# EAGLE design pcb_khamex_zenit_V0.1_rev_5.6 (EAGLE 7.6.0)

## Sheet 1 of 2
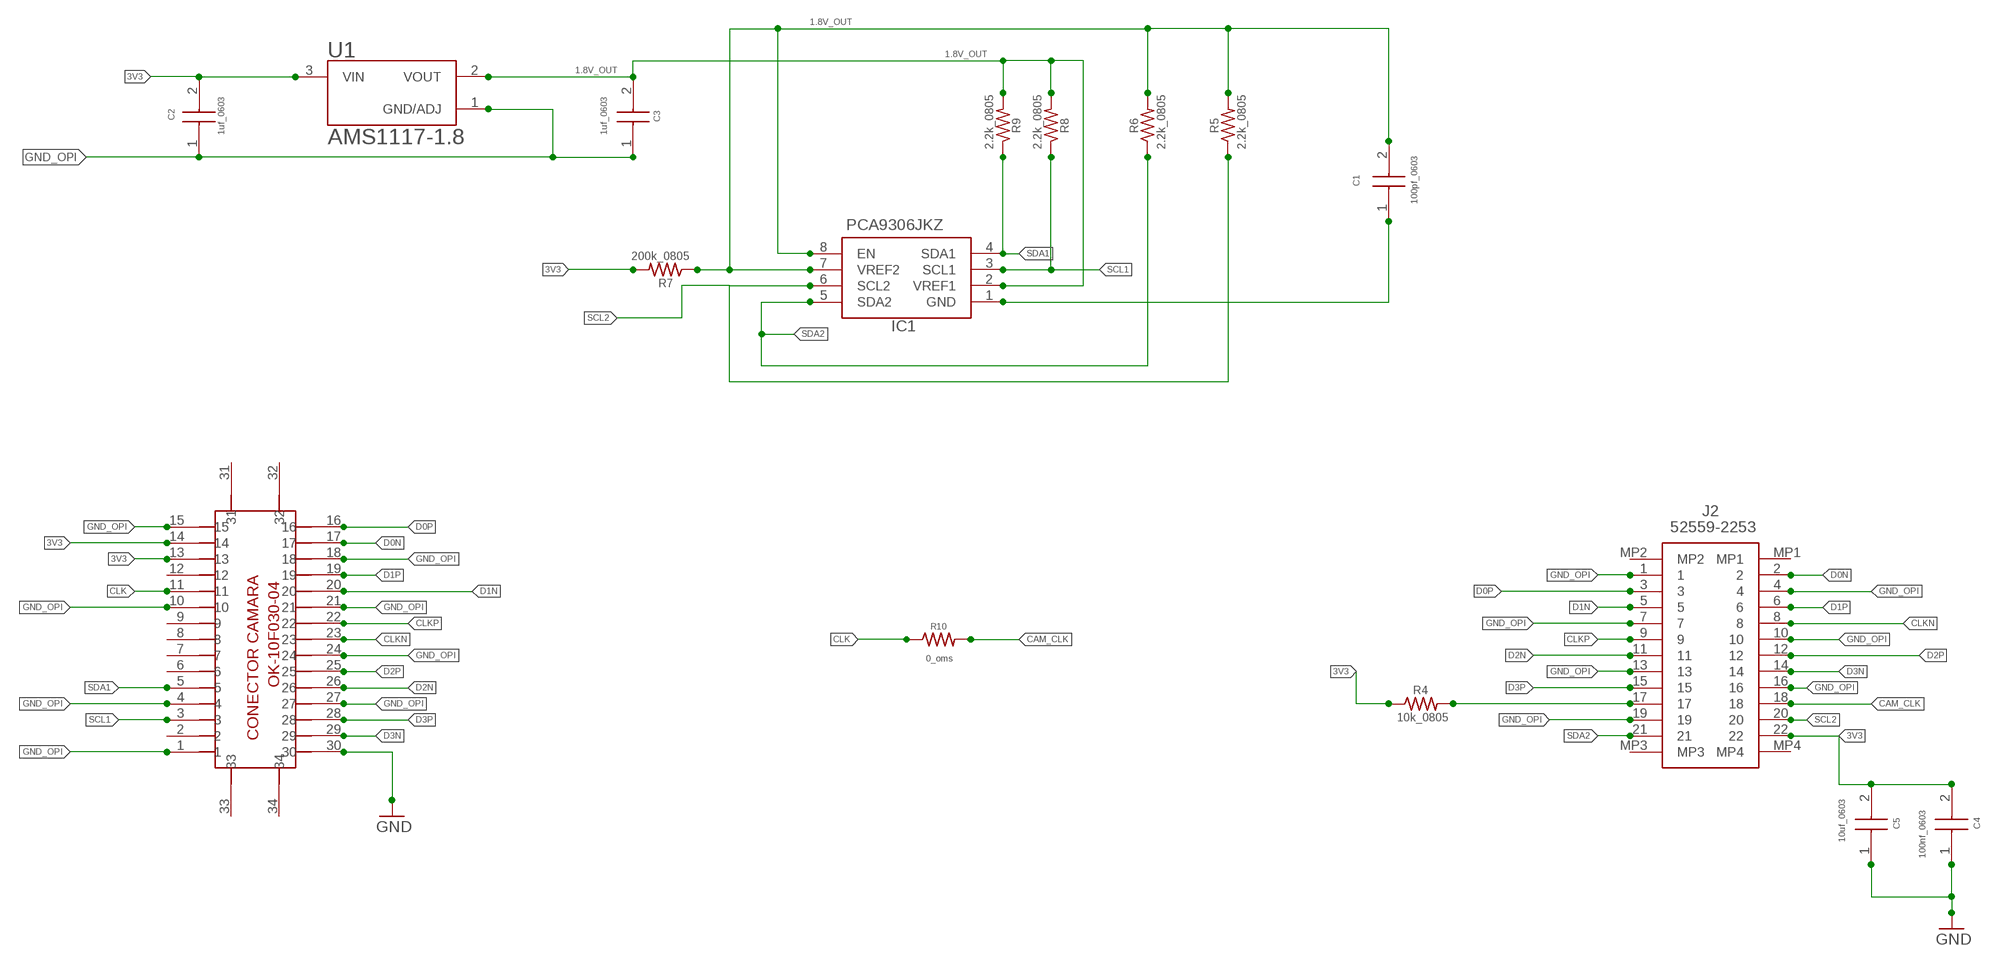
[diagram p0: schematic, sheet 1, part 1 of 2]
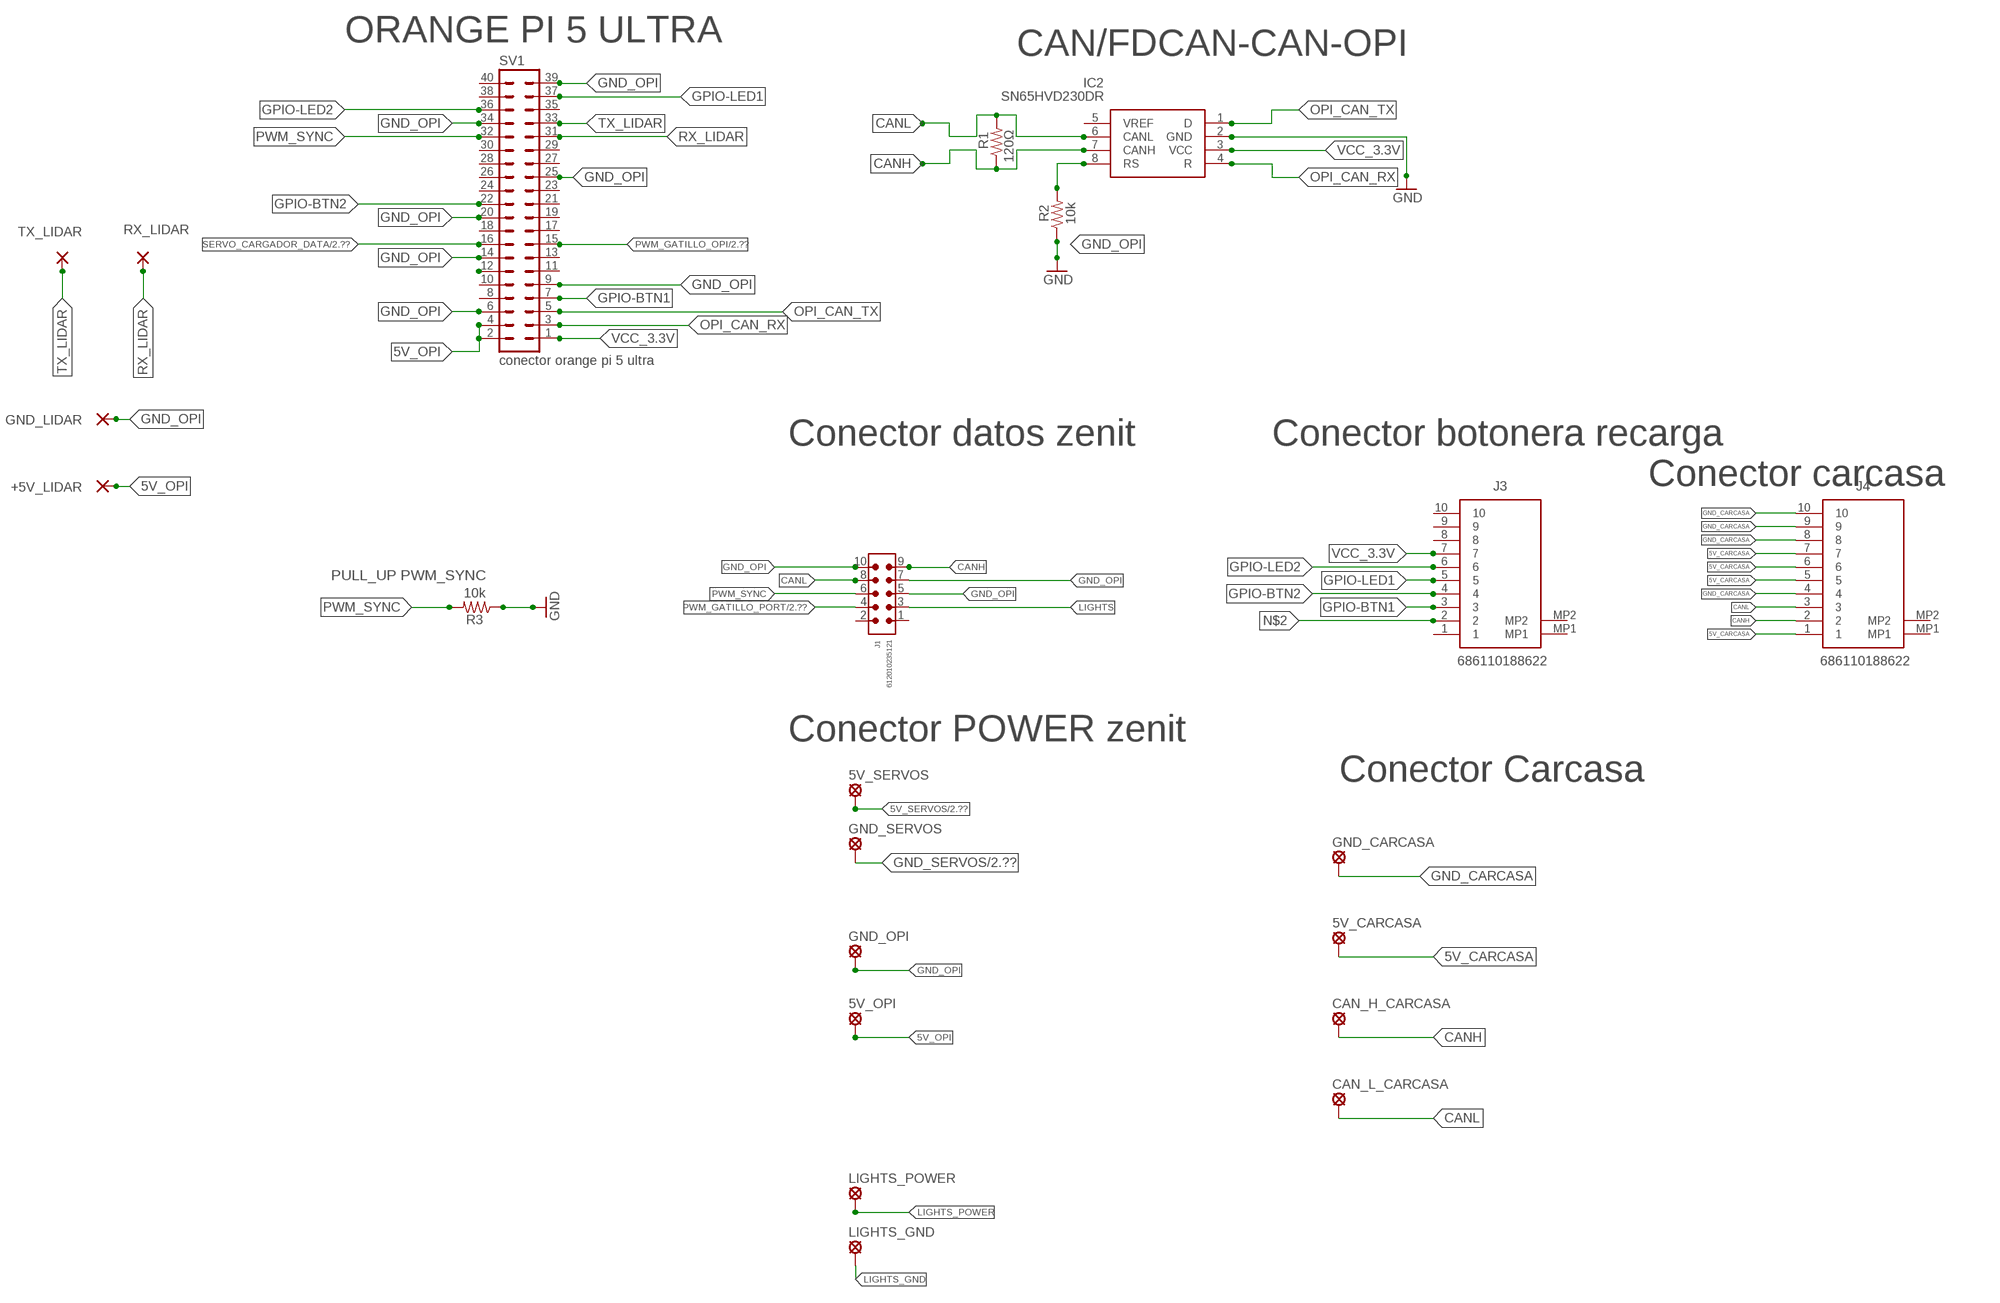
[diagram p1: schematic, sheet 1, part 2 of 2]

### Parts
5V_CARCASA  SE14  [SE14]
5V_OPI  SE14  [SE14]
5V_SERVOS  SE14  [SE14]
+5V_LIDAR  WIREPAD1,6/0,8  [1,6/0,8]
C1  100pf_0603  06033U101FAT2A  [CAPC1608X90N]
C2  1uf_0603  06033U101FAT2A  [CAPC1608X90N]
C3  1uf_0603  06033U101FAT2A  [CAPC1608X90N]
C4  100nf_0603  06033U101FAT2A  [CAPC1608X90N]
C5  10uf_0603  06033U101FAT2A  [CAPC1608X90N]
CAN_H_CARCASA  SE14  [SE14]
CAN_L_CARCASA  SE14  [SE14]
GND_CARCASA  SE14  [SE14]
GND_LIDAR  WIREPAD1,6/0,8  [1,6/0,8]
GND_OPI  SE14  [SE14]
GND_SERVOS  SE14  [SE14]
IC1  PCA9306JKZ  [PCA9306JKZ]
IC2  SN65HVD230DR  [SOT127P600X175-8N]
J1  612010235121  6120XX235121_612010235121  [612010235121]
J2  52559-2253  [525592253]
J3  686110188622  [686110188622]
J4  686110188622  [686110188622]
LIGHTS_GND  SE14  [SE14]
LIGHTS_POWER  SE14  [SE14]
R1  120Ω  R-US_M0805  [M0805]
R2  10k  R-US_M0805  [M0805]
R3  10k  R-US_R0603  [R0603]
R4  10k_0805  R-US_M0805  [M0805]
R5  2.2k_0805  R-US_M0805  [M0805]
R6  2.2k_0805  R-US_M0805  [M0805]
R7  200k_0805  R-US_M0805  [M0805]
R8  2.2k_0805  R-US_M0805  [M0805]
R9  2.2k_0805  R-US_M0805  [M0805]
R10  0_oms  R-US_M0805  [M0805]
RX_LIDAR  WIREPAD1,6/0,8  [1,6/0,8]
SV1  conector orange pi 5 ultra  MA20-2  [MA20-2]
TX_LIDAR  WIREPAD1,6/0,8  [1,6/0,8]
U1  AMS1117-1.8  [SOT229P700X180-4N]
U$1  OK-10F030-04_DEVICE  [OK-10F030-04_PACKAGE]

### Nets
1.8V: C3.2 IC1.2(VREF1) R8.2 R9.2 U1.2(VOUT)
3V3 [power]: C2.2 C4.2 C5.2 J2.22 R4.1 R7.2 U1.3(VIN) U$1.13 U$1.14
5V_CARCASA: 5V_CARCASA.MP J4.1 J4.5 J4.6 J4.7
5V_OPI: 5V_OPI.MP +5V_LIDAR.1(P) SV1.2 SV1.4
5V_SERVOS: 5V_SERVOS.MP ; also sheet 2
CAM_CLK: J2.18 R10.2
CANH: CAN_H_CARCASA.MP IC2.7(CANH) J1.9 J4.2 R1.1
CANL: CAN_L_CARCASA.MP IC2.6(CANL) J1.8 J4.3 R1.2
CLK: R10.1 U$1.11
CLKN: J2.8 U$1.23
CLKP: J2.9 U$1.22
D0N: J2.2 U$1.17
D0P: J2.3 U$1.16
D1N: J2.5 U$1.20
D1P: J2.6 U$1.19
D2N: J2.11 U$1.26
D2P: J2.12 U$1.25
D3N: J2.14 U$1.29
D3P [power]: J2.15 U$1.28
GND_CARCASA [power]: GND_CARCASA.MP J4.4 J4.8 J4.9 J4.10
GND_OPI [power]: C2.1 C3.1 C4.1 C5.1 GND_LIDAR.1(P) GND_OPI.MP IC2.2(GND) J1.5 J1.7 J1.10 J2.1 J2.4 J2.7 J2.10 J2.13 J2.16 J2.19 R2.1 R3.1 SV1.6 SV1.9 SV1.14 SV1.20 SV1.25 SV1.34 SV1.39 U1.1(GND/ADJ) U$1.1 U$1.4 U$1.10 U$1.15 U$1.18 U$1.21 U$1.24 U$1.27 U$1.30 ; supply symbol labelled GND ; also sheet 2
GND_SERVOS: GND_SERVOS.MP ; also sheet 2
GPIO-BTN1: J3.3 SV1.7
GPIO-BTN2: J3.4 SV1.22
GPIO-LED1: J3.5 SV1.37
GPIO-LED2: J3.6 SV1.36
LIGHTS [power]: J1.3
LIGHTS_GND [power]: LIGHTS_GND.MP
LIGHTS_POWER [power]: LIGHTS_POWER.MP
N$1: C1.1 IC1.1(GND)
N$2: J3.2
N$6: C1.2 IC1.7(VREF2) IC1.8(EN) R5.2 R6.2 R7.1
N$7: J2.17 R4.2
N$9: SV1.12
N$15: IC2.8(RS) R2.2
OPI_CAN_RX: IC2.4(R) SV1.3
OPI_CAN_TX: IC2.1(D) SV1.5
PWM_GATILLO_OPI: SV1.15 ; also sheet 2
PWM_GATILLO_PORT: J1.4 ; also sheet 2
PWM_SYNC: J1.6 R3.2 SV1.32
RX_LIDAR: RX_LIDAR.1(P) SV1.31
SCL1: IC1.3(SCL1) R8.1 U$1.3
SCL2: IC1.6(SCL2) J2.20 R5.1
SDA1: IC1.4(SDA1) R9.1 U$1.5
SDA2: IC1.5(SDA2) J2.21 R6.1
SERVO_CARGADOR_DATA: SV1.16 ; also sheet 2
TX_LIDAR: SV1.33 TX_LIDAR.1(P)
VCC_3.3V: IC2.3(VCC) J3.7 SV1.1
Unconnected: IC2.5(VREF) J1.1 J1.2 J2.MP1 J2.MP2 J2.MP3 J2.MP4 J3.1 J3.8 J3.9 J3.10 J3.MP1 J3.MP2 J4.MP1 J4.MP2 SV1.8 SV1.10 SV1.11 SV1.13 SV1.17 SV1.18 SV1.19 SV1.21 SV1.23 SV1.24 SV1.26 SV1.27 SV1.28 SV1.29 SV1.30 SV1.35 SV1.38 SV1.40 U$1.2 U$1.6 U$1.7 U$1.8 U$1.9 U$1.12 U$1.31 U$1.32 U$1.33 U$1.34

### Notes on the sheet
- 1.8V_OUT
- 1.8V_OUT
- 1.8V_OUT
- ORANGE PI 5 ULTRA
- CAN/FDCAN-CAN-OPI
- Conector datos zenit | Conector botonera recarga
- Conector carcasa
- PULL_UP PWM_SYNC
- Conector POWER zenit
- Conector Carcasa

## Sheet 2 of 2
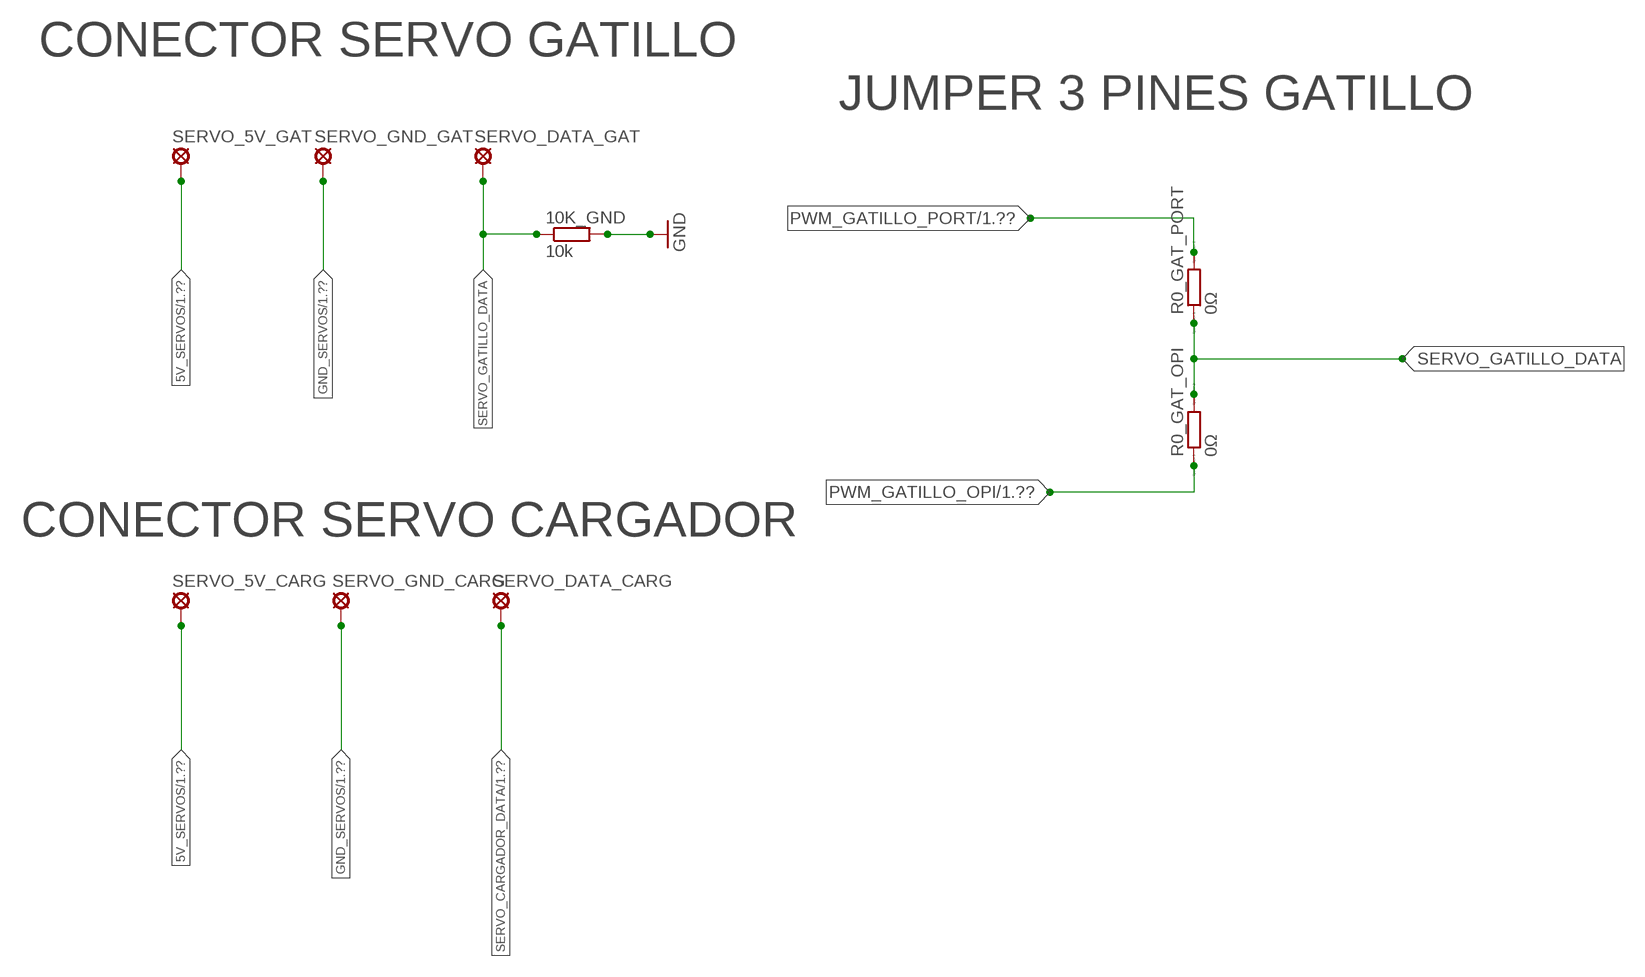
[diagram p2: schematic, sheet 2]

### Parts
10K_GND  10k  R-EU_R0603  [R0603]
R0_GAT_OPI  0Ω  RR0603  [R0603]
R0_GAT_PORT  0Ω  RR0603  [R0603]
SERVO_5V_CARG  SE14  [SE14]
SERVO_5V_GAT  SE14  [SE14]
SERVO_DATA_CARG  SE14  [SE14]
SERVO_DATA_GAT  SE14  [SE14]
SERVO_GND_CARG  SE14  [SE14]
SERVO_GND_GAT  SE14  [SE14]

### Nets
5V_SERVOS: SERVO_5V_CARG.MP SERVO_5V_GAT.MP ; also sheet 1
GND_OPI [power]: 10K_GND.2 ; supply symbol labelled GND ; also sheet 1
GND_SERVOS: SERVO_GND_CARG.MP SERVO_GND_GAT.MP ; also sheet 1
PWM_GATILLO_OPI: R0_GAT_OPI.1 ; also sheet 1
PWM_GATILLO_PORT: R0_GAT_PORT.2 ; also sheet 1
SERVO_CARGADOR_DATA: SERVO_DATA_CARG.MP ; also sheet 1
SERVO_GATILLO_DATA: 10K_GND.1 R0_GAT_OPI.2 R0_GAT_PORT.1 SERVO_DATA_GAT.MP

### Notes on the sheet
- CONECTOR SERVO GATILLO
- JUMPER 3 PINES GATILLO
- CONECTOR SERVO CARGADOR

## Library data of the parts
5V_CARCASA 5V_OPI 5V_SERVOS CAN_H_CARCASA CAN_L_CARCASA GND_CARCASA GND_OPI GND_SERVOS LIGHTS_GND LIGHTS_POWER SERVO_5V_CARG SERVO_5V_GAT SERVO_DATA_CARG SERVO_DATA_GAT SERVO_GND_CARG SERVO_GND_GAT = solpad:SE14: SOLDER PAD E1553, drill 1,4mm, distributor Buerklin, 07F820
10K_GND = rcl_dani:R-EU_: RESISTOR, European symbol
+5V_LIDAR GND_LIDAR RX_LIDAR TX_LIDAR = wirepad:WIREPAD: Wire PAD connect wire on PCB
C1-C5 = 06033U101FAT2A:06033U101FAT2A: Multilayer Ceramic Capacitors MLCC - SMD/SMT 25V 100pF C0G 0603 1% Tol Source: Datasheet <https://componentsearchengine.com/Datasheets/1/06031A100FAT2A.pdf>; DESCRIPTION: Multilayer Ceramic Capacitors MLCC - SMD/SMT 25V 100pF C0G 0603 1% Tol; HEIGHT: 0.9mm; MANUFACTURER_NAME: Kyocera AVX; MANUFACTURER_PART_NUMBER: 06033U101FAT2A
IC1 = PCA9306JKZ:PCA9306JKZ: Voltage Level Translator Bidirectional 1 Circuit 2 Channel 8-X2SON (1.35x1) , 1.8 V ~ 5.5 V , -40C ~ 105C (TA) Source: Datasheet <https://www.nxp.com/docs/en/data-sheet/PCA9306.pdf>; DESCRIPTION: Voltage Level Translator Bidirectional 1 Circuit 2 Channel 8-X2SON (1.35x1) , 1.8 V ~ 5.5 V , -40C ~ 105C (TA); HEIGHT: 0.33mm; MANUFACTURER_NAME: NXP; MANUFACTURER_PART_NUMBER: PCA9306JKZ
IC2 = SN65HVD230DR:SN65HVD230DR: 3.3 V CAN Transceiver with Standby Mode Source: Datasheet <http://www.ti.com/lit/gpn/sn65hvd230>; DESCRIPTION: 3.3 V CAN Transceiver with Standby Mode; HEIGHT: 1.75mm; MANUFACTURER_NAME: Texas Instruments; MANUFACTURER_PART_NUMBER: SN65HVD230DR; MOUSER_PART_NUMBER: 595-SN65HVD230DR; MOUSER_PRICE-STOCK: https://www.mouser.co.uk/ProductDetail/Texas-Instruments/SN65HVD230DR?qs=QViXGNcIEAtifeQR3pYVUQ%3D%3D
J1 = Eagle_WR-BHD_rev24a:6120XX235121_612010235121: WR-BHD 2.54 mm Male Box Header High Temperature KIND PROPERTIES: Pitch 2.54 mm Gender:Male MATERIAL PROPERTIES: Insulator Material:PA6T Insulator Flammability Rating UL94 V-0 Insulator Color:Black Contact Material :Copper Alloy Contact Plating :Gold Contact Type: Stamped GENERAL INFORMATION: Operating Temperature:-40 °C up to +125 °C Compliance:RoHS Working Voltage: 250 V (AC) Withstanding Voltage:500 V (AC) Contact Resistance: 20 mΩ Insulation Resistance:1000 MΩ PACKAGING PROPERTIES Packaging :Tray <https://www.we-online.com/catalog/media/o32904v209%20Family_WR-BHD_6120xx235121.jpg> Details see: https://www.we-online.com/catalog/en/BHD_2_54_MALE_BOX_HEADER_HIGH_TEMPERATURE_6120XX235121 Updated by Ella Wu 2021-03-12 2021 (C) Würth Elektronik; CONTACT-RESISTANCE: 20mOhm; DATASHEET-URL: https://www.we-online.com/redexpert/spec/612010235121?ae; GENDER: Male; IR: 3A; LENGTH: 20.3mm; MOUNT: THT; PACKAGING: Tray; PART-NUMBER: 612010235121; PINS: 10; PITCH: 2.54mm; TYPE: Straight; WORKING-VOLTAGE: 250V(AC)
J2 = 52559-2253:52559-2253: 0.5 MM FPC CONNECTOR Source: Datasheet; DESCRIPTION: 0.5 MM FPC CONNECTOR; HEIGHT: 5.55mm; MANUFACTURER_NAME: Molex; MANUFACTURER_PART_NUMBER: 52559-2253; MOUSER_PART_NUMBER: 538-52559-2253; MOUSER_PRICE-STOCK: https://www.mouser.co.uk/ProductDetail/Molex/52559-2253?qs=nDwhpid8gJaCOR81Wp3jsw%3D%3D
J3 J4 = 686110188622:686110188622: FFC & FPC Connectors WR-FPC 1,0mm SMT Horiz. Top Contact Tin Plating{0000} Source: Datasheet <https://www.mouser.ch/datasheet/2/445/686110188622-1843591.pdf>; DESCRIPTION: FFC & FPC Connectors WR-FPC 1,0mm SMT Horiz. Top Contact Tin Plating{0000}; HEIGHT: 3.3mm; MANUFACTURER_NAME: Wurth Elektronik; MANUFACTURER_PART_NUMBER: 686110188622; MOUSER_PART_NUMBER: 710-686110188622; MOUSER_PRICE-STOCK: https://www.mouser.co.uk/ProductDetail/Wurth-Elektronik/686110188622?qs=OlC7AqGiEDnHUpT6yh27Lg%3D%3D
R0_GAT_OPI R0_GAT_PORT = eagle-ltspice:R: RESISTOR, European symbol; SPICEMODEL: NONE; SPICEPREFIX: R
R1-R10 = rcl:R-US_: RESISTOR, American symbol
SV1 = con-lstb:MA20-2: PIN HEADER; OC_FARNELL: unknown; OC_NEWARK: unknown
U1 = AMS1117-1.8 (1):AMS1117-1.8: Check availability <https://pricing.snapeda.com/parts/AMS1117-1.8-TR/ams/view-part?ref=eda>; AVAILABILITY: Not in stock; CHECK_PRICES: https://www.snapeda.com/parts/AMS1117-1.8-TR/ams/view-part/?ref=eda; MF: ams; MP: AMS1117-1.8-TR; PACKAGE: SOT-223 Seeed Technology; PRICE: None; SNAPEDA_LINK: https://www.snapeda.com/parts/AMS1117-1.8-TR/ams/view-part/?ref=snap
U$1 = OK-10F030-04_LIBRARY_2:OK-10F030-04_DEVICE: Conector para las camaras del Orange Pi 5 Ultra 30 pines click

## Net classes
0 default: width 0.15 mm, drill 0.3 mm, clearance 0.15 mm
1 power: width 0.127 mm, drill 0.305 mm, clearance 0.127 mm
2 thin: width 0.254 mm, drill 0.254 mm, clearance 0.254 mm
3 mipi: width 0.15 mm, drill 0.2 mm, clearance 0.15 mm

## Board
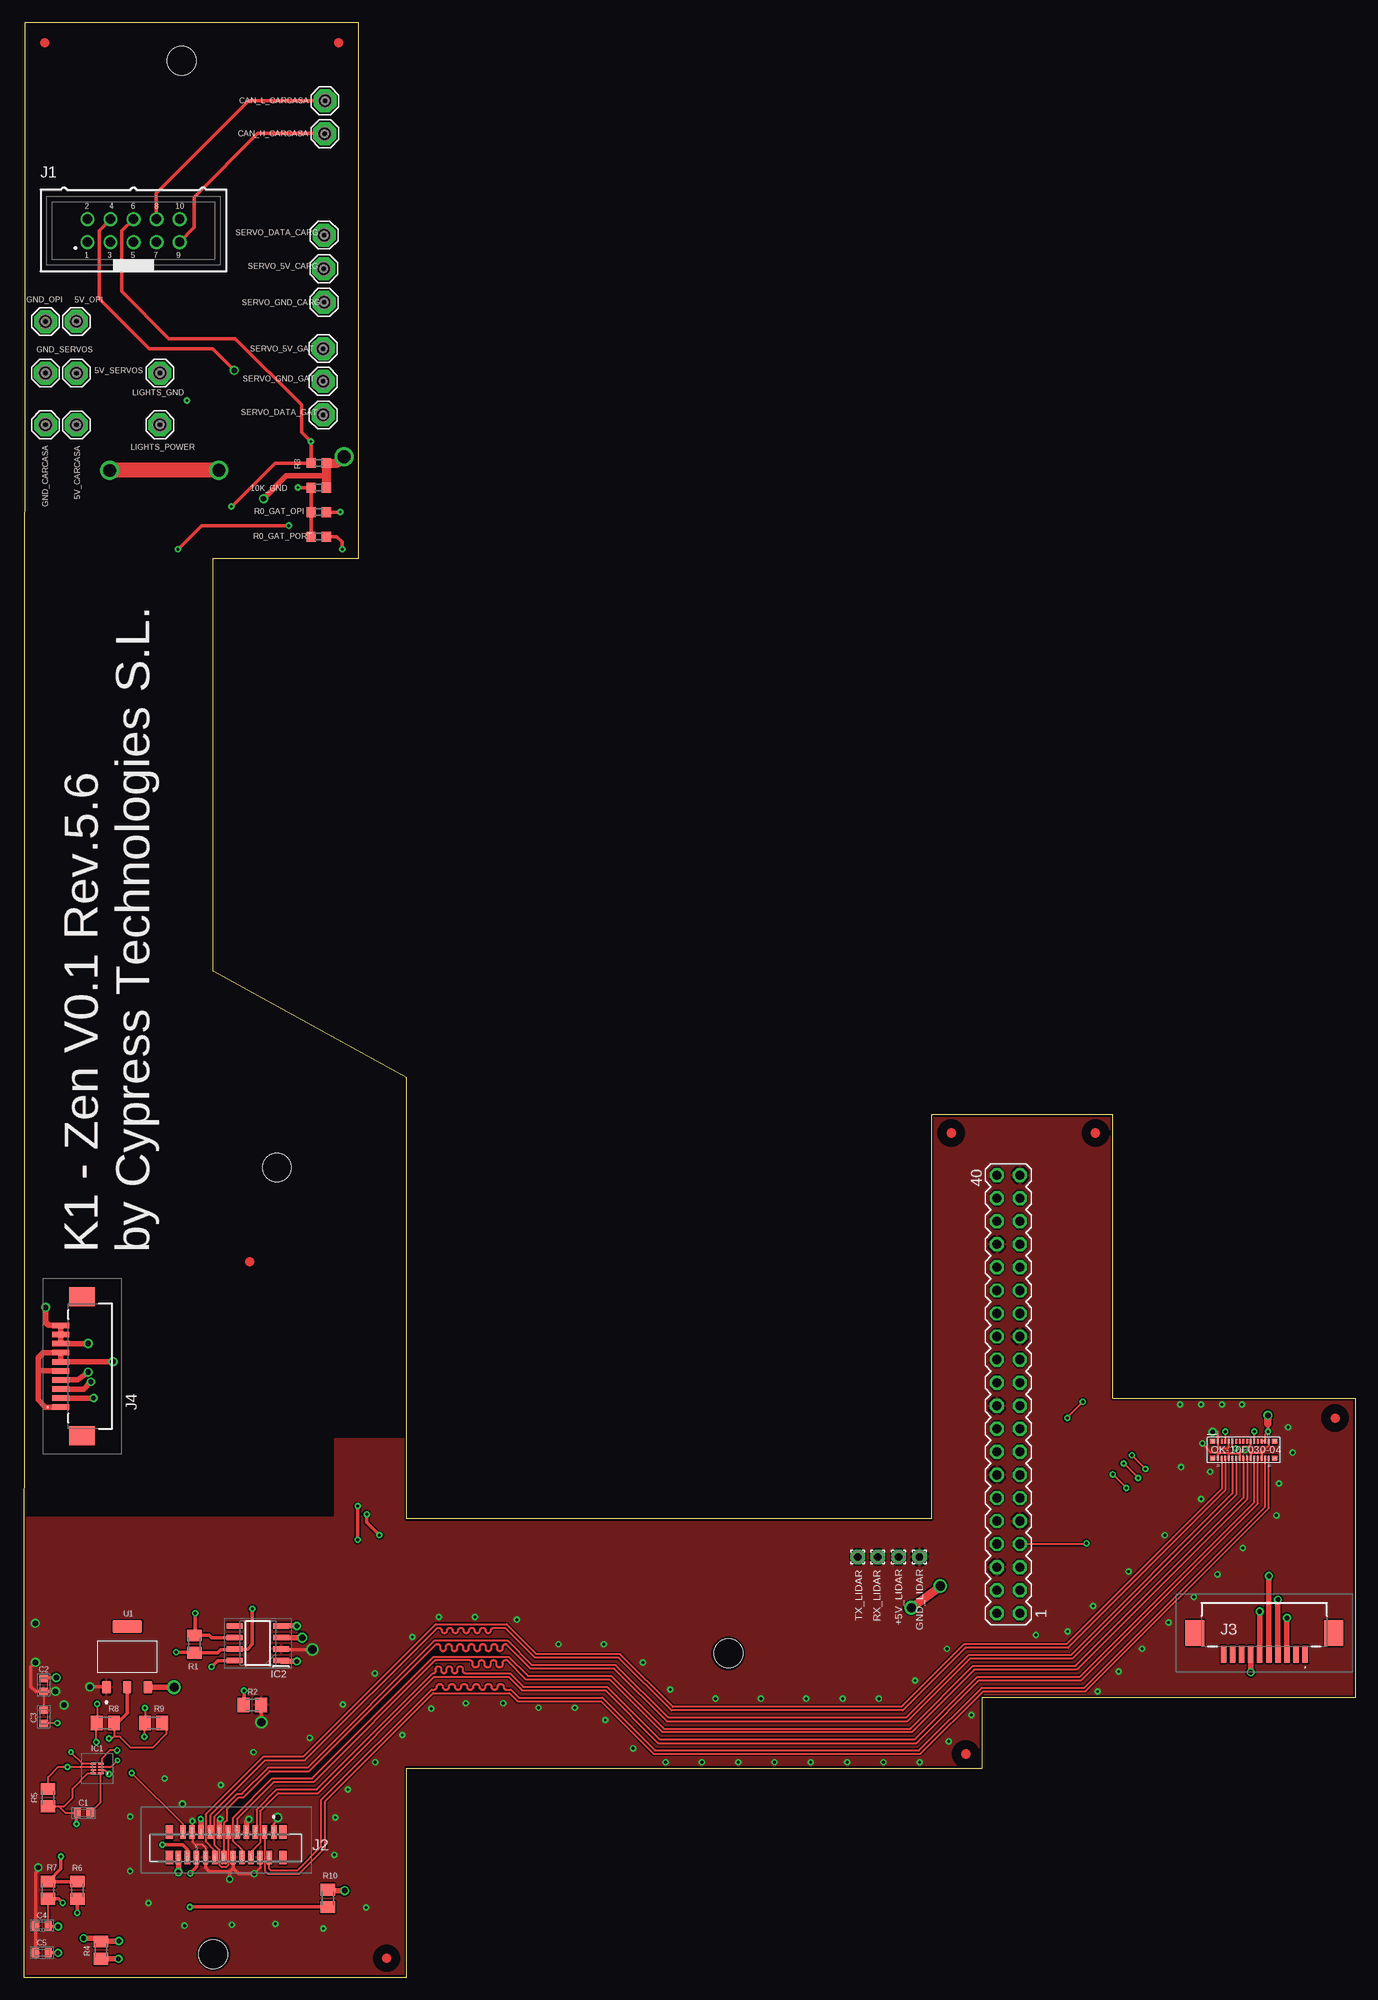
[diagram p3: board, top side]
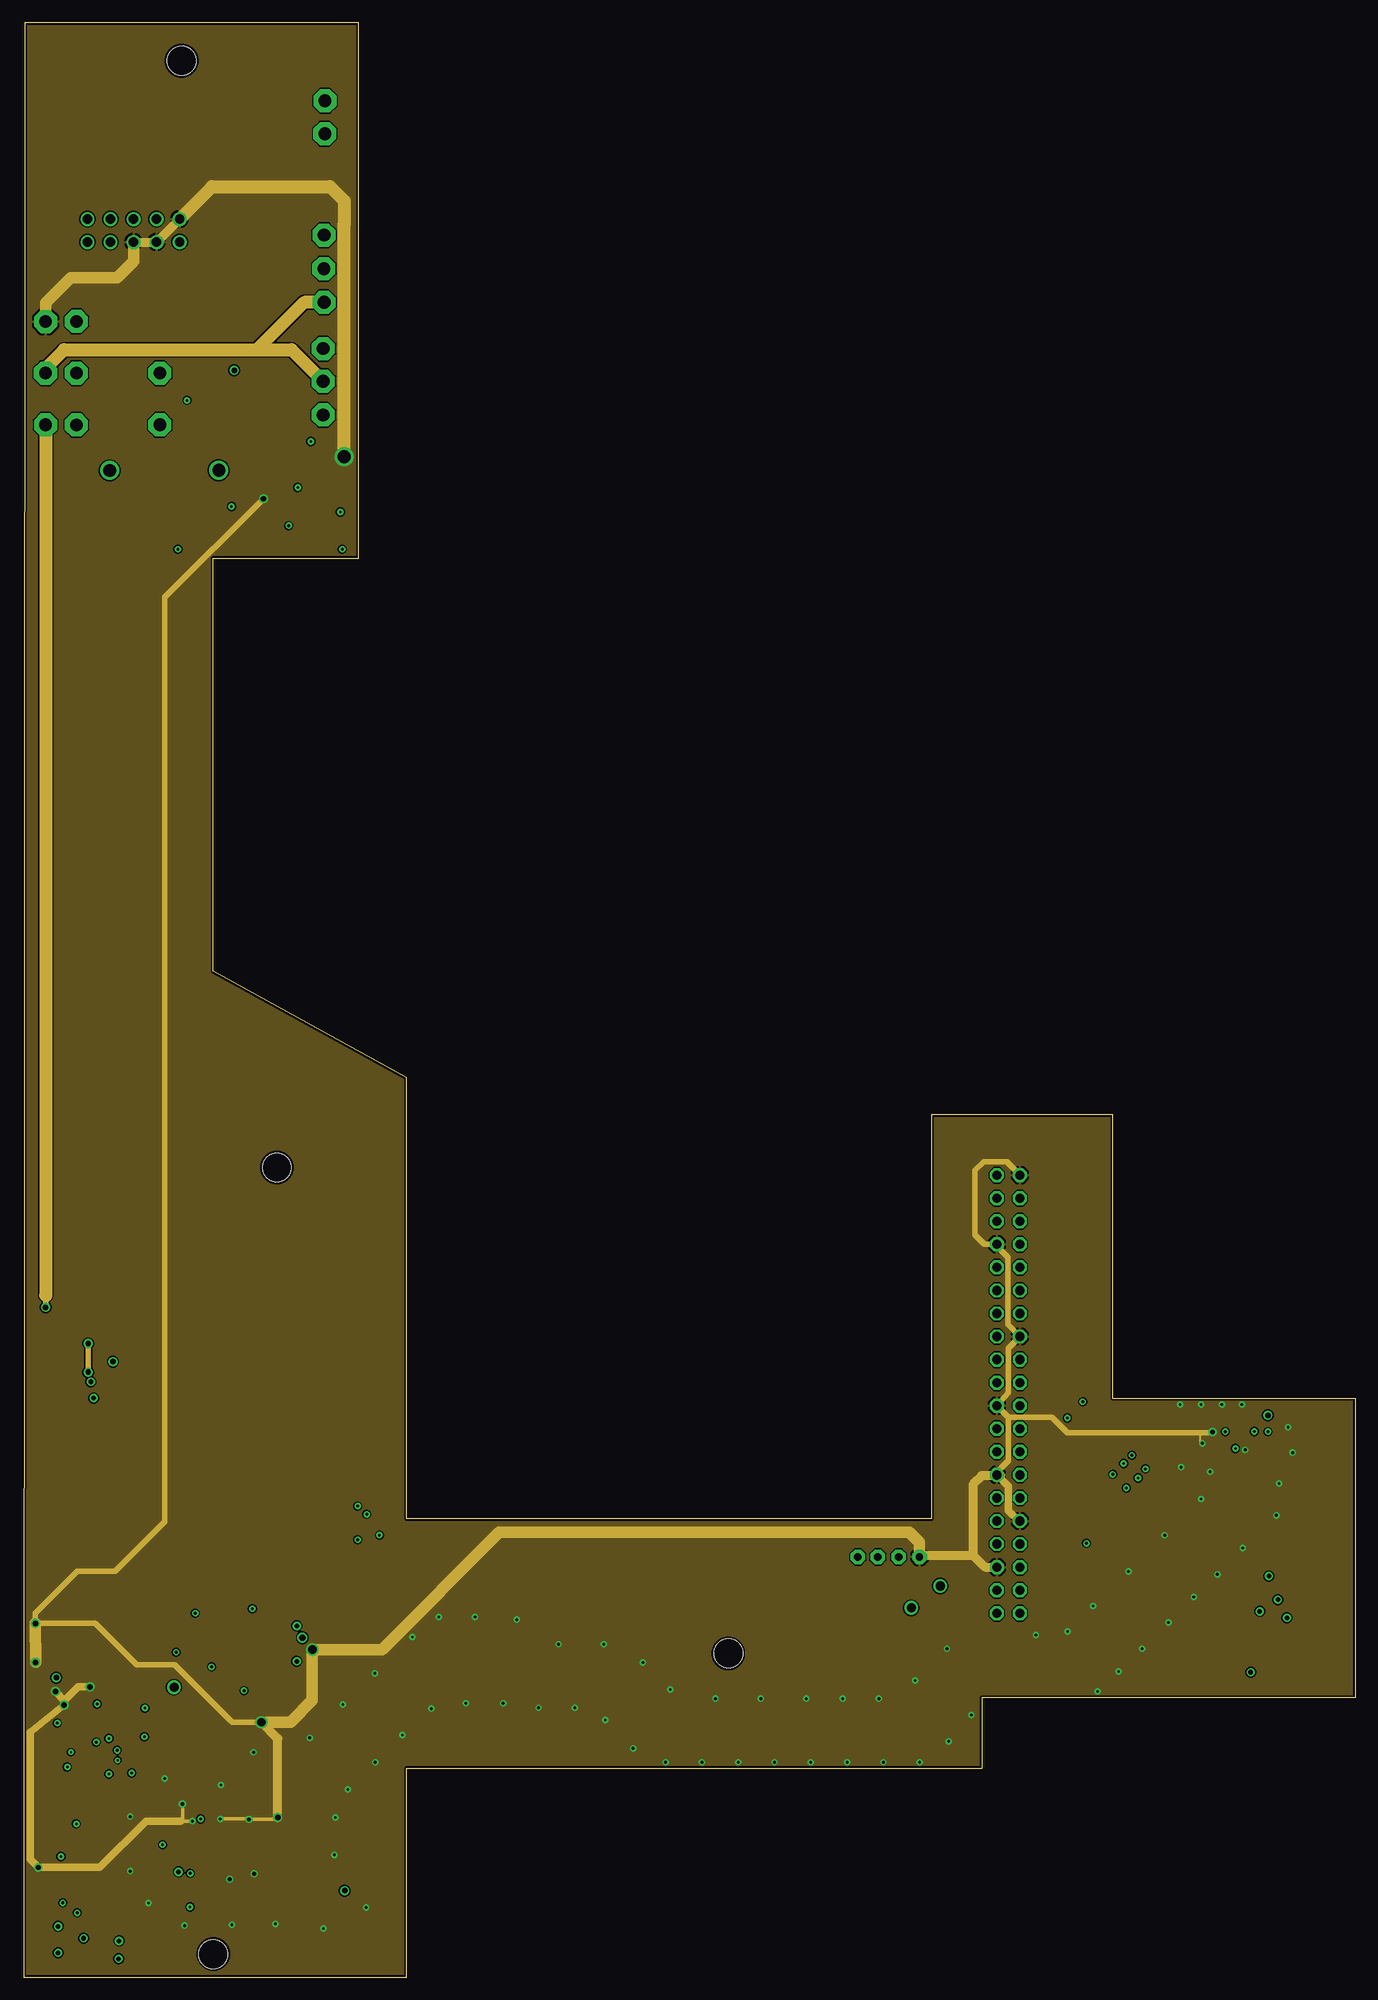
[diagram p4: board, inner layer GND_PLANE]
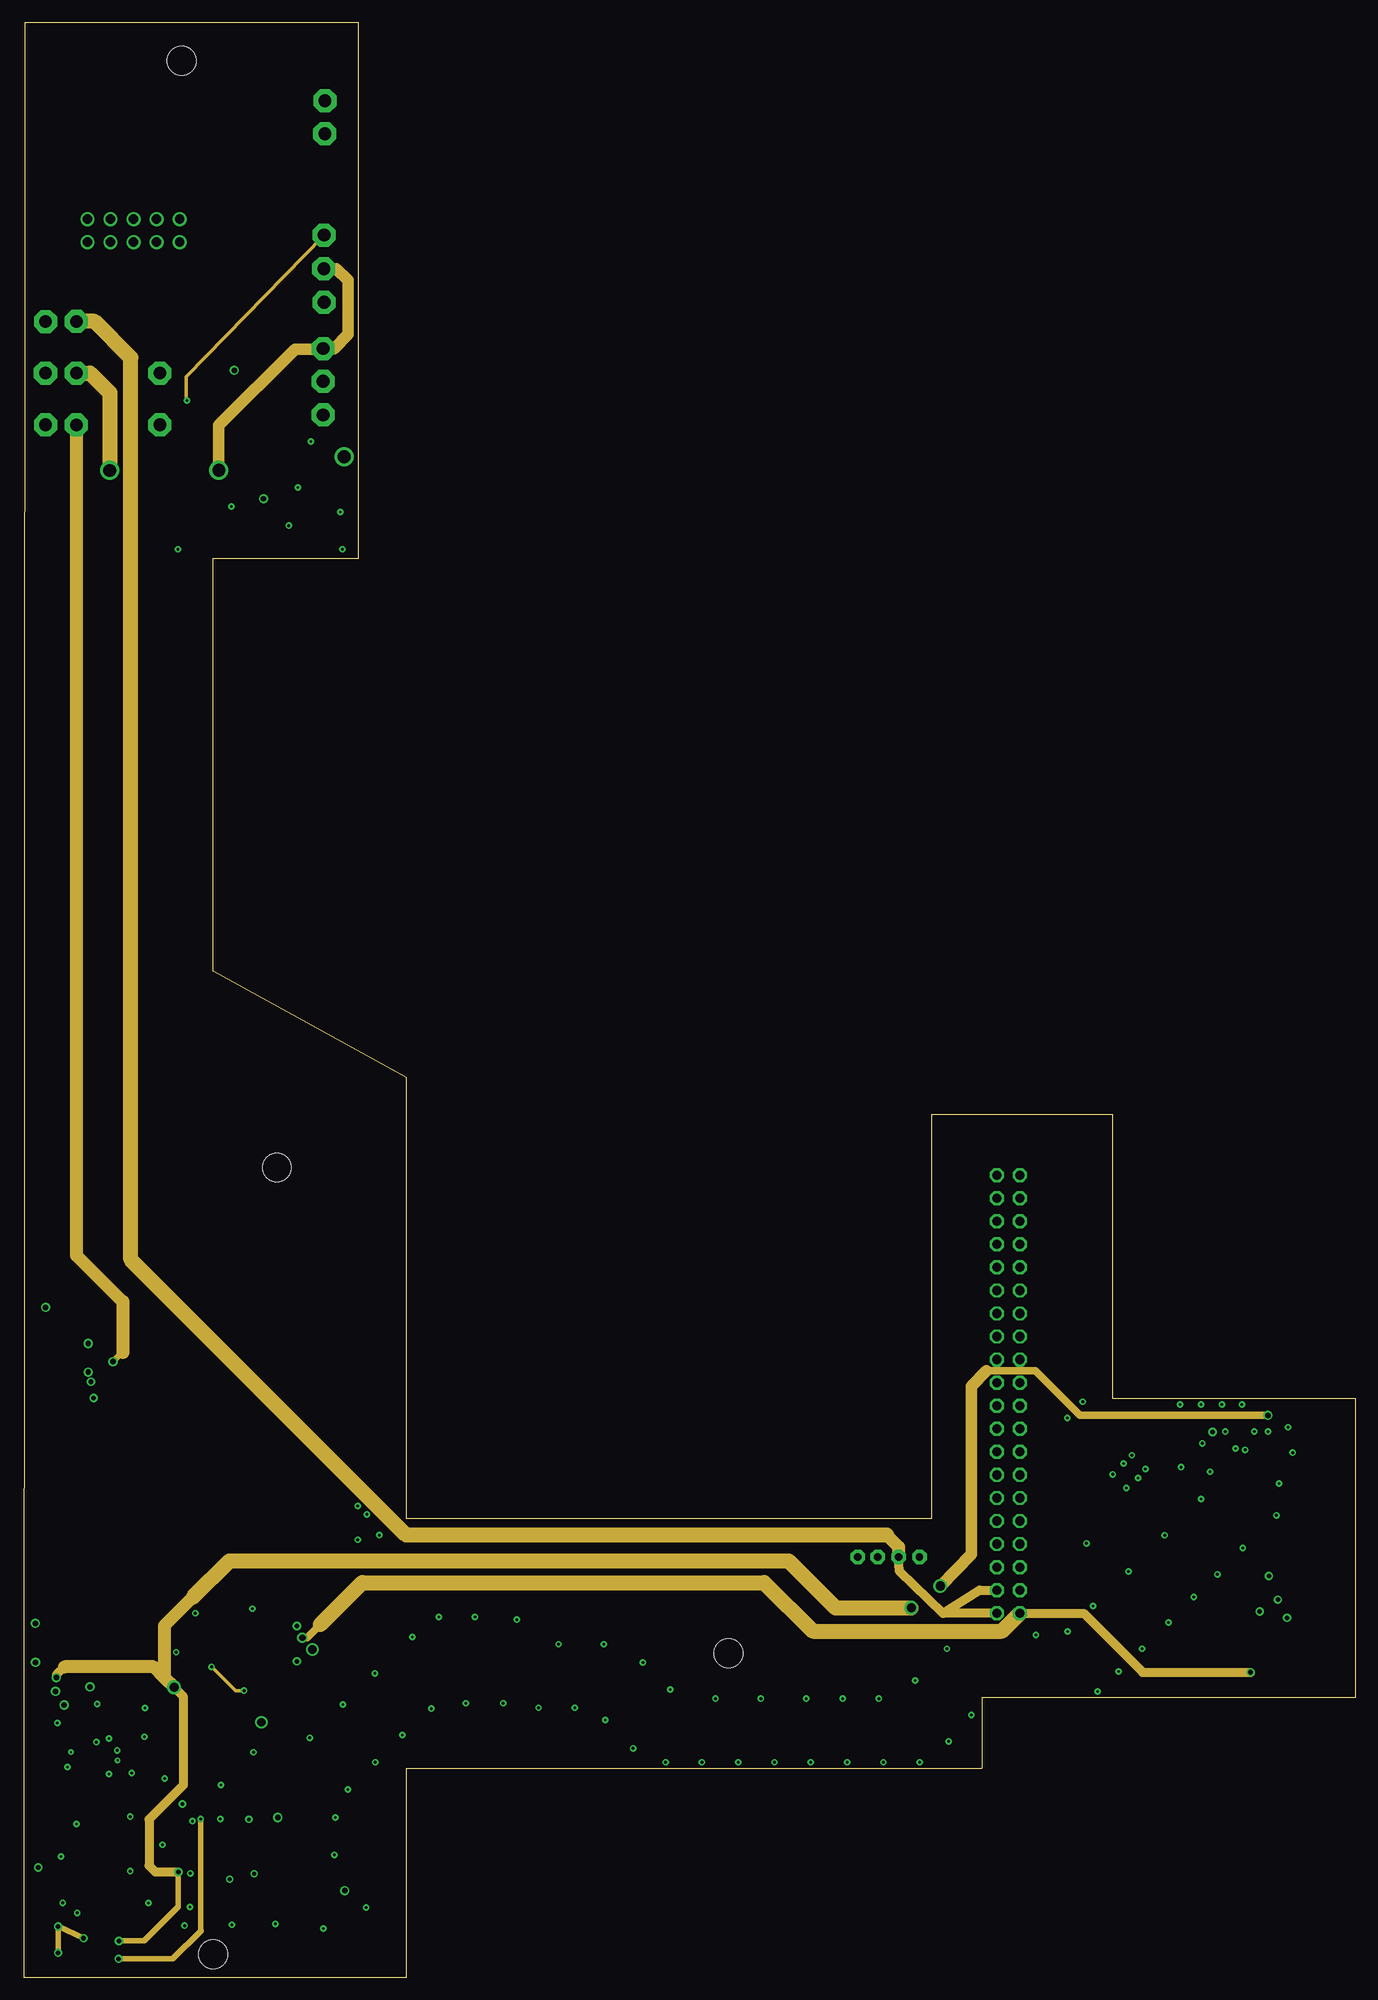
[diagram p5: board, inner layer POWER]
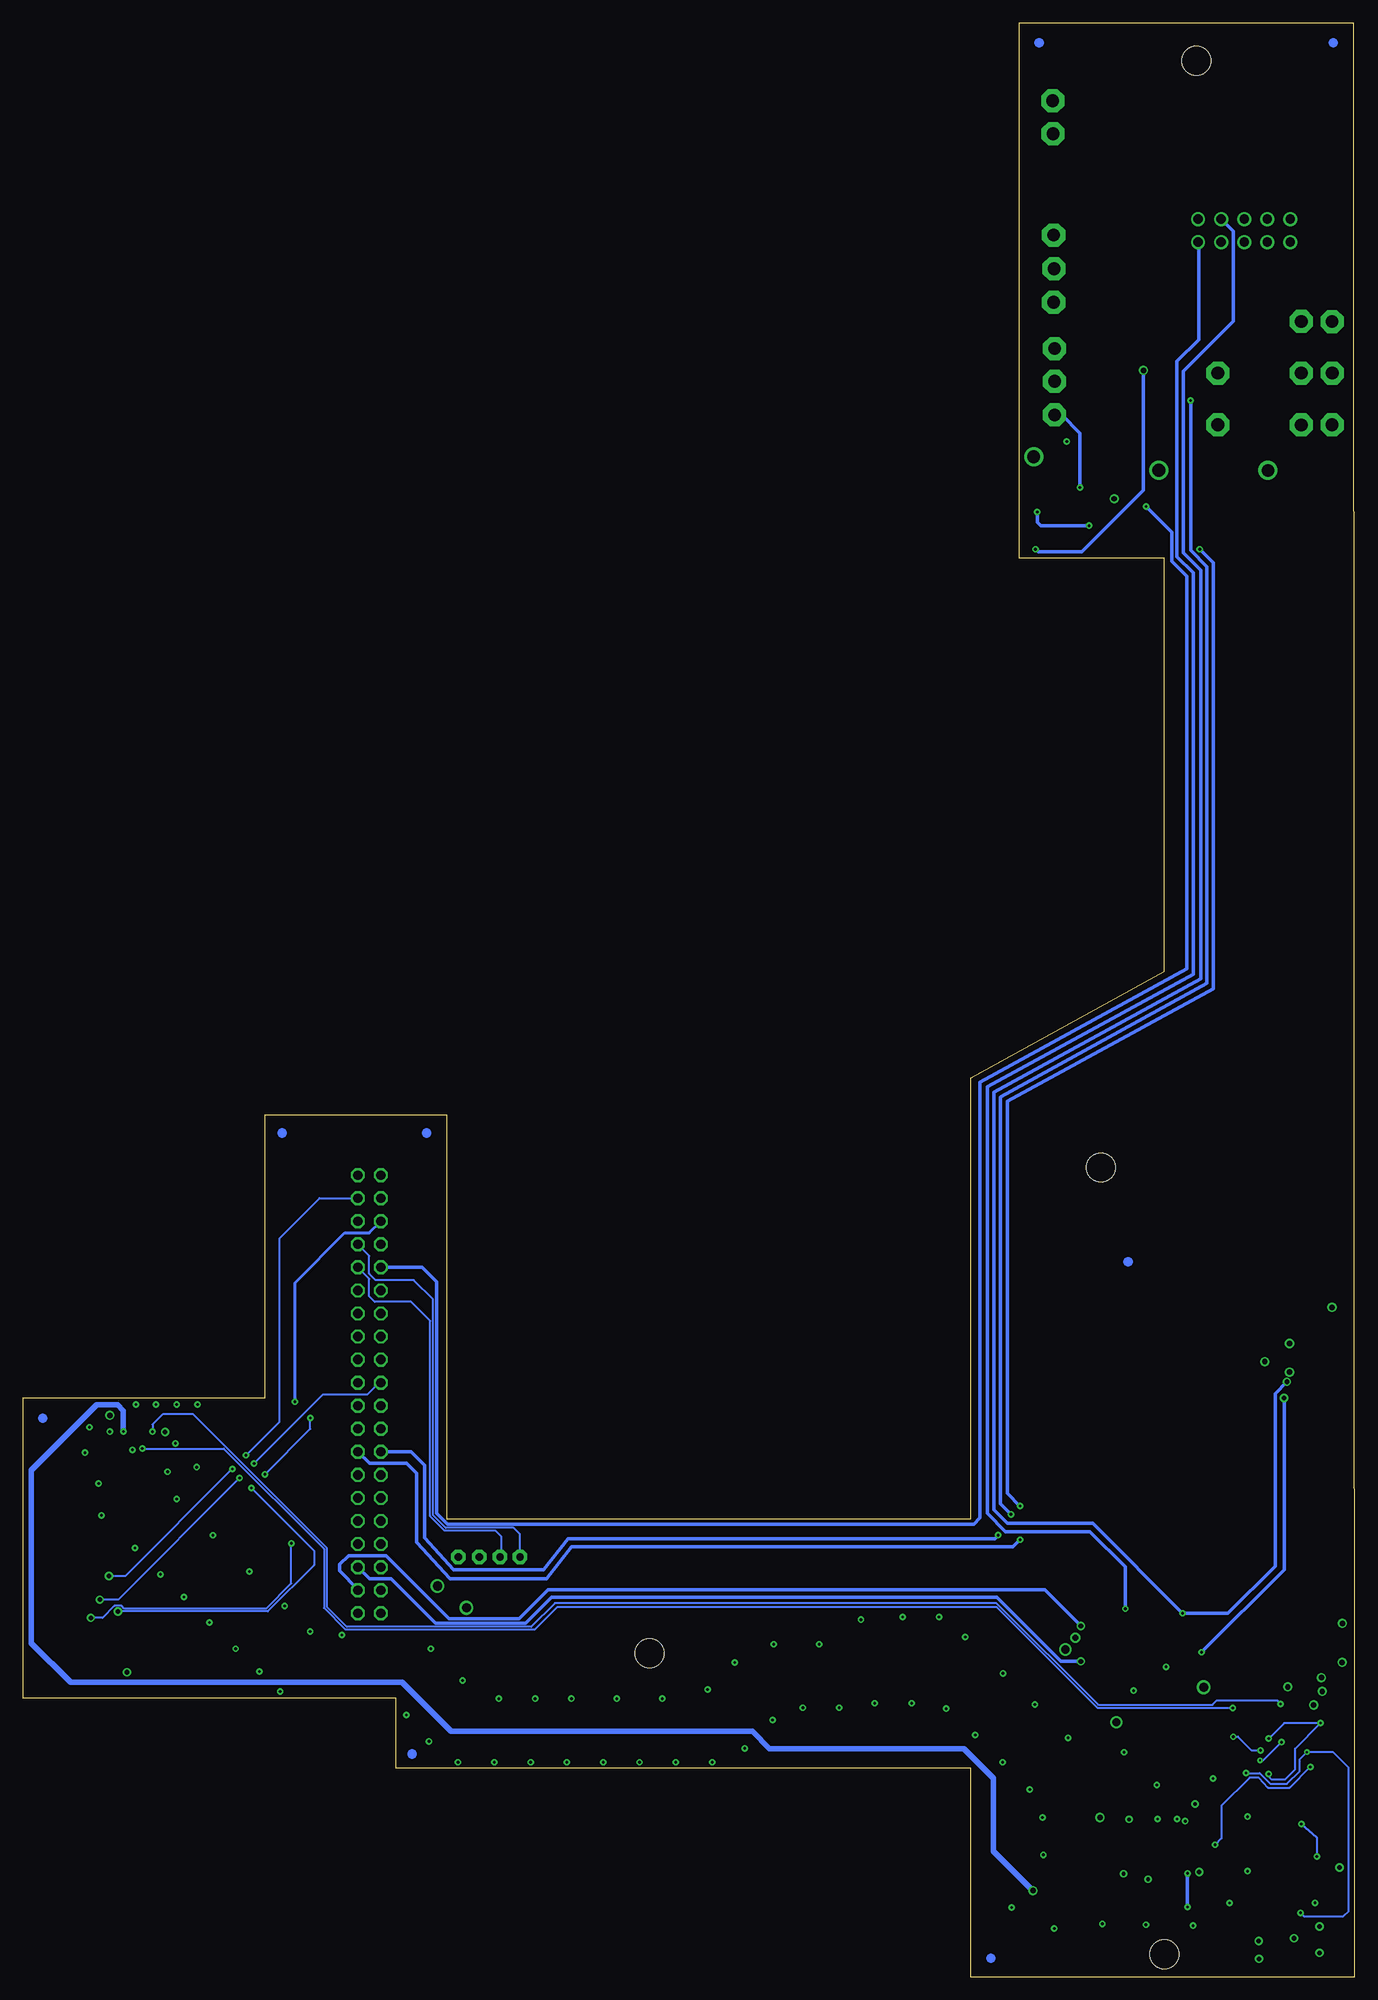
[diagram p6: board, bottom side, seen from below]

Size 146.7 x 215.3 mm. Coordinates in mm from the lower left corner, seen from the top.
Outline: 0,0 42.2,0 42.2,23 105.6,23 105.6,30.8 110.5,30.8 146.7,30.8 146.7,63.8 120,63.8 120,95 100,95 100,50.5 42.2,50.5 42.2,99.1 20.9,110.8 20.9,156.3 36.9,156.3 36.9,215.3 0.1,215.3 0,0
Copper layers (1*2*15*16): Top 0.035mm / dielectric 0.2mm / GND_PLANE 0.035mm / dielectric 1.1mm / POWER 0.035mm / dielectric 0.2mm / Bottom 0.035mm
Design rules "default *": minimum track width 6mil, minimum drill 8mil, track to track 6mil, track to pad 6mil, pad to pad 6mil, via to via 6mil, smd to smd 0mil, copper to edge 10mil, drill to drill 8mil, minimum pad ring 10mil, minimum via ring 8mil, stop-mask expansion 4mil, vias tented up to drill 0mil, thermal gap 10mil
Holes 3.2 mm at 17.4,211.1 77.65,35.68 20.89,2.55 27.9,89.2

### Footprints (pad centres in the part's own frame; a part is rotated, then mirrored left to right if it is on the bottom)
SE14 = drill 1.397 pad 2.54 octagon: MP 0,0
R0603 = smd 1 x 1.1: 1 -0.85,0; 2 0.85,0
1,6/0,8 = drill 0.813 pad 1.6 octagon: 1 0,0
CAPC1608X90N = smd 0.78 x 0.99: 1 -0.7,0; 2 0.7,0
PCA9306JKZ = smd 0.65 x 0.17: 1 -0.4,0.525 | smd 0.6 x 0.17: 2 -0.425,0.175; 3 -0.425,-0.175; 4 -0.425,-0.525; 5 0.425,-0.525; 6 0.425,-0.175; 7 0.425,0.175; 8 0.425,0.525
SOT127P600X175-8N = smd 1.75 x 0.6: 1 -2.55,1.905; 2 -2.55,0.635; 3 -2.55,-0.635; 4 -2.55,-1.905; 5 2.55,-1.905; 6 2.55,-0.635; 7 2.55,0.635; 8 2.55,1.905
612010235121 = drill 1.02: 1 -5.08,-1.27; 2 -5.08,1.27; 3 -2.54,-1.27; 4 -2.54,1.27; 5 0,-1.27; 6 0,1.27; 7 2.54,-1.27; 8 2.54,1.27; 9 5.08,-1.27; 10 5.08,1.27
525592253 = smd 0.6 x 1.5: 1 -5.25,-1.4; 2 -4.75,1.4; 3 -4.25,-1.4; 4 -3.75,1.4; 5 -3.25,-1.4; 6 -2.75,1.4; 7 -2.25,-1.4; 8 -1.75,1.4; 9 -1.25,-1.4; 10 -0.75,1.4; 11 -0.25,-1.4; 12 0.25,1.4; 13 0.75,-1.4; 14 1.25,1.4; 15 1.75,-1.4; 16 2.25,1.4; 17 2.75,-1.4; 18 3.25,1.4; 19 3.75,-1.4; 20 4.25,1.4; 21 4.75,-1.4; 22 5.25,1.4 | smd 0.8 x 1.5: MP1 -6.25,1.4; MP2 -6.25,-1.4; MP3 6.25,-1.4; MP4 6.25,1.4
686110188622 = smd 0.6 x 1.9: 1 -4.5,2.825; 2 -3.5,2.825; 3 -2.5,2.825; 4 -1.5,2.825; 5 -0.5,2.825; 6 0.5,2.825; 7 1.5,2.825; 8 2.5,2.825; 9 3.5,2.825; 10 4.5,2.825 | smd 2.1 x 2.8: MP1 -7.65,0.475; MP2 7.65,0.475
M0805 = smd 1.3 x 1.6: 1 -0.95,0; 2 0.95,0
MA20-2 = drill 1.016 octagon: 1 -24.13,-1.27; 2 -24.13,1.27; 3 -21.59,-1.27; 4 -21.59,1.27; 5 -19.05,-1.27; 6 -19.05,1.27; 7 -16.51,-1.27; 8 -16.51,1.27; 9 -13.97,-1.27; 10 -13.97,1.27; 11 -11.43,-1.27; 12 -11.43,1.27; 13 -8.89,-1.27; 14 -8.89,1.27; 15 -6.35,-1.27; 16 -6.35,1.27; 17 -3.81,-1.27; 18 -3.81,1.27; 19 -1.27,-1.27; 20 -1.27,1.27; 21 1.27,-1.27; 22 1.27,1.27; 23 3.81,-1.27; 24 3.81,1.27; 25 6.35,-1.27; 26 6.35,1.27; 27 8.89,-1.27; 28 8.89,1.27; 29 11.43,-1.27; 30 11.43,1.27; 31 13.97,-1.27; 32 13.97,1.27; 33 16.51,-1.27; 34 16.51,1.27; 35 19.05,-1.27; 36 19.05,1.27; 37 21.59,-1.27; 38 21.59,1.27; 39 24.13,-1.27; 40 24.13,1.27
SOT229P700X180-4N = smd 1.31 x 0.93: 1 -3.345,2.29; 2 -3.345,0; 3 -3.345,-2.29 | smd 1.31 x 3.24: 4 3.345,0
OK-10F030-04_PACKAGE = smd 0.22 x 0.55: 1 -2.8,0.925; 2 -2.4,0.925; 3 -2,0.925; 4 -1.6,0.925; 5 -1.2,0.925; 6 -0.8,0.925; 7 -0.4,0.925; 8 0,0.925; 9 0.4,0.925; 10 0.8,0.925; 11 1.2,0.925; 12 1.6,0.925; 13 2,0.925; 14 2.4,0.925; 15 2.8,0.925; 16 2.8,-0.925; 17 2.4,-0.925; 18 2,-0.925; 19 1.6,-0.925; 20 1.2,-0.925; 21 0.8,-0.925; 22 0.4,-0.925; 23 0,-0.925; 24 -0.4,-0.925; 25 -0.8,-0.925; 26 -1.2,-0.925; 27 -1.6,-0.925; 28 -2,-0.925; 29 -2.4,-0.925; 30 -2.8,-0.925 | smd 0.6 x 0.55: 31 -3.4,0.925; 32 -3.39,-0.935; 33 3.42,0.935; 34 3.42,-0.925

### Placement (x,y rotation side)
5V_CARCASA  5.81,171 180 top
5V_OPI  5.81,182.4 270 top
5V_SERVOS  5.81,176.7 270 top
10K_GND  32.5,164.1 0 top
+5V_LIDAR  96.4,46.3 180 top
C1  6.6,18.1 180 top
C2  2.2,32.2 90 top
C3  2.2,28.7 270 top
C4  2,5.7 0 top
C5  2,2.7 0 top
CAN_H_CARCASA  33.17,203.07 180 top
CAN_L_CARCASA  33.2,206.7 180 top
GND_CARCASA  2.41,171.01 180 top
GND_LIDAR  98.7,46.3 180 top
GND_OPI  2.41,182.38 270 top
GND_SERVOS  2.4,176.71 270 top
IC1  8.1,23 180 top
IC2  25.8,36.8 180 top
J1  12.1,192.4 0 top
J2  22.3,14.6 180 top
J3  136.7,38.4 180 top
J4  6.9,67.3 90 top
LIGHTS_GND  15,176.71 90 top
LIGHTS_POWER  15,171.01 270 top
R0_GAT_OPI  32.5,161.4 180 top
R0_GAT_PORT  32.5,158.7 0 top
R1  18.8,36.7 90 top
R2  25.2,30 180 top
R3  32.5,166.8 180 top
R4  8.5,3 270 top
R5  2.7,19.8 270 top
R6  5.9,9.6 90 top
R7  2.7,9.6 270 top
R8  9,28 0 top
R9  14.3,28 0 top
R10  33.5,8.7 270 top
RX_LIDAR  94.1,46.3 180 top
SERVO_5V_CARG  33.06,188.2 0 top
SERVO_5V_GAT  33,179.4 0 top
SERVO_DATA_CARG  33.1,191.9 0 top
SERVO_DATA_GAT  33,172.1 0 top
SERVO_GND_CARG  33.1,184.5 0 top
SERVO_GND_GAT  33,175.8 0 top
SV1  108.5,64.23 90 top
TX_LIDAR  91.9,46.3 180 top
U1  11.4,35.3 90 top
U$1  134.4,58.1 0 top
U$2  [CIRCLE-1MM-3R]  2.3,213.1 0 top
U$3  [CIRCLE-1MM-3R]  34.7,213.1 0 top
U$4  [CIRCLE-1MM-3R]  24.9,78.8 0 top
U$5  [CIRCLE-1MM-3R]  40,2.1 0 top
U$6  [CIRCLE-1MM-3R]  103.8,24.6 0 top
U$7  [CIRCLE-1MM-3R]  144.5,61.6 0 top
U$8  [CIRCLE-1MM-3R]  118.1,93 0 top
U$9  [CIRCLE-1MM-3R]  102.2,93 0 top

### Tracks (layer width: path | path; a pad name or v marks a point on that pad's centre or on a via)
1.8V  (via drill 0.3 pad 0.2)
  Top 0.2: IC1.2 8.97,22.82 v9.4,22.4 | v3.7,28 C3.2 | 10.3,28 R8.2 9.95,26.55 | R9.2 15.3,27.95 15.7,27.95 15.7,26.8 14.2,25.3 11.8,25.3 10.6,26.5 10,26.5 9.95,26.55 | v9.4,26.3 9.7,26.3 9.95,26.55
  Top 0.406: 10.3,28 11.4,29.1 U1.2
  Bottom 0.2: v9.4,22.4 9.4,22.1 9.1,21.8 7.6,21.8 6.5,22.9 6.5,25.2 v3.7,28 7.7,28 v9.4,26.3
3V3  (via drill 0.3, 0.3 pad 0.2, 0.5, 0.5 pad 0.2, 0.6, 1)
  Top 0.2: 2.8,5.6 C4.2 R7.2 | 10.45,3.95 v10.5,4 | C2.2 2.3,33 | U$1.13 U$1.14 136.8,59.8 v137.1,60.1
  Top 0.305: 137.1,61 v137.1,60.1
  Top 0.406: 2.3,33 v3.6,33 | R7.2 3.85,8.65 v4.3,8.2 | C5.2 v3.8,2.7 | 2.8,5.6 v3.8,5.6
  Top 0.61: v10.5,4 10.5,3.95 R4.1 8.15,4.3 v6.6,4.3 | J2.22 v17.05,11.61 | U1.3 v16.57,31.95
  Top 0.813: v137.1,61.9 137.1,61
  Top 1.016: v97.8,40.7 v101,43.1
  POWER 0.61: v3.8,2.7 v3.8,5.6 v6.6,4.3 | v10.5,4 13.25,4 17.04,7.79 v17.04,11.6
  POWER 0.813: 106.1,66.8 111.5,66.8 116.4,61.9 v137.1,61.9
  POWER 1.016: v17.05,11.61 v17.04,11.6 14.5,11.6 13.8,12.3 13.8,17.4 17.6,21.2 17.6,30.9 16.57,31.93 v16.57,31.95 | 4.5,34.2 3.6,33.3 v3.6,33
  POWER 1.27: v101,43.1 104.4,46.6 104.4,65.1 106.1,66.8
  POWER 1.422: 18.7,41.9 15.5,38.7 15.5,33.02 | 15.5,33.02 14.32,34.2 4.5,34.2 | 15.5,33.02 v16.57,31.95
  POWER 1.676: 18.7,41.9 22.67,45.87 84.28,45.87 89.45,40.7 v97.8,40.7
5V_CARCASA  (via drill 0.6)
  Top 0.61: 1.78,66.8 1.6,66.8 1.59,66.81 1.59,68.22 2.17,68.8 J4.7 4.09,68.78 4.09,67.82 | 1.78,66.8 J4.5 | v9.83,67.82 4.09,67.82 | 4.09,67.82 J4.6 | J4.1 2.38,62.8 1.58,63.6 1.58,66.6 1.78,66.8
  POWER 0.61: 10.94,68.81 10.82,68.81 v9.83,67.82
  POWER 1.422: 5V_CARCASA.MP 5.81,79.52 10.91,74.42 10.91,68.84 10.94,68.81
5V_OPI
  POWER 1.016: SV1.2 101.3,40.1 | 101.3,40.1 96.5,44.7 +5V_LIDAR.1 | 101.3,40.1 105.32,42.64 SV1.4
  POWER 1.422: 95.1,48.7 96.4,47.4 +5V_LIDAR.1
  POWER 1.676: 5V_OPI.MP 7.8,182.4 11.8,178.4 11.8,79.04 42.14,48.7 95.1,48.7
5V_SERVOS  (via drill 1.4)
  Top 1.676: v21.5,166 v9.48,165.98
  POWER 1.27: v21.5,166 21.5,170.94 29.91,179.35 32.95,179.35 SERVO_5V_GAT.MP 34.19,179.4 35.75,180.96 35.75,186.91 34.45,188.21 SERVO_5V_CARG.MP
  POWER 1.676: 5V_SERVOS.MP 7.32,176.7 9.48,174.54 v9.48,165.98
CAM_CLK  (via drill 0.3, 0.3 pad 0.2)
  Top 0.406: J2.18 19.05,12.15 v18.35,11.45 | v18.33,7.75 R10.2
  Bottom 0.406: v18.35,11.45 18.35,7.97 v18.33,7.75
CANH  (via drill 0.3, 0.5)
  Top 0.406: v16.8,35.8 18.75,35.8 R1.1 21.35,35.75 21.7,36.1 23.18,36.1 IC2.7 24.69,36.16 25.2,36.67 v25.2,40.6 | J1.9 18.8,192.75 18.8,196.1 25.8,203.1 33.14,203.1 CAN_H_CARCASA.MP
  Top 0.61: J4.2 v7.7,63.8
  Bottom 0.406: J1.9 17.1,191.05 17.1,180.4 19.5,178 19.5,156.5 17.7,154.7 17.7,110.5 40.4,98.1 40.4,51.1 38.4,49.1 29.1,49.1 25.2,45.2 v25.2,40.6 | v16.8,35.8 7.7,44.9 v7.7,63.8
CANL  (via drill 0.3, 0.5)
  Top 0.406: v18.9,40.1 18.9,37.75 R1.2 20.45,37.65 20.7,37.4 23.21,37.4 IC2.6 | J1.8 14.6,193.71 14.6,196.5 24.8,206.7 CAN_L_CARCASA.MP
  Top 0.61: J4.3 6.6,64.8 v7.4,65.6
  Bottom 0.406: J1.8 13.3,192.33 13.3,182.4 18.8,176.9 18.8,156.9 16.9,155 16.9,110 39.7,97.5 39.7,51.5 38.2,50 28.8,50 v18.9,40.1 13.9,40.1 8.7,45.3 8.7,64.3 v7.4,65.6
CLK  (via drill 0.3, 0.6)
  Top 0.2: U$1.11 v135.6,60.12
  Top 0.406: 33.45,9.6 R10.1
  Top 0.61: 33.45,9.6 33.51,9.54 v35.38,9.54
  Bottom 0.61: v35.38,9.54 39.72,13.88 39.72,21.92 43,25.2 64.4,25.2 66.3,27.1 99.5,27.1 104.9,32.5 107.4,32.5 107.42,32.48 141.43,32.48 145.76,36.81 145.76,55.83 138.53,63.06 136.23,63.06 135.6,62.43 v135.6,60.12
CLKN
  Top 0.15: 24,13.8 24,13.25 J2.8
  Top 0.2: 24,13.8 24,14.08 23.04,15.04 23.04,17.54 27.4,21.9 31.79,21.9 45.19,35.3 53.45,35.3 55.55,33.2 64.74,33.2 70.54,27.4 97.69,27.4 104.59,34.3 115.89,34.3 134.4,52.81 U$1.23
CLKP
  Top 0.15: 23.5,16.05 J2.9
  Top 0.2: J2.9 arc-90 23.5,16.05 23.5,17.44 27.56,21.5 31.95,21.5 45.35,34.9 49.18,34.9 arc-90 49.47,34.61 49.47,34.42 arc90 49.76,34.13 49.84,34.13 arc90 50.13,34.42 50.13,34.61 arc-90 50.42,34.9 50.5,34.9 arc-90 50.79,34.61 50.79,34.42 arc90 51.08,34.13 51.15,34.13 arc90 51.44,34.42 51.44,34.61 arc-90 51.73,34.9 51.81,34.9 arc-90 52.1,34.61 52.1,34.42 arc90 52.39,34.13 52.47,34.13 arc90 52.76,34.42 52.76,34.61 arc-90 53.05,34.9 53.28,34.9 55.38,32.8 64.58,32.8 70.38,27 97.85,27 104.75,33.9 116.04,33.9 134.8,52.66 U$1.22
D0N
  Top 0.2: 27.1,13.25 J2.2 27,13.15 27,11.99 27.19,11.8 30.19,11.8 32.8,14.41 32.8,19.54 44.95,31.69 45.22,31.69 arc90 45.51,31.98 45.51,32.02 arc-90 45.8,32.31 45.89,32.31 arc-90 46.18,32.02 46.18,31.98 arc90 46.47,31.69 46.56,31.69 arc90 46.85,31.98 46.85,32.02 arc-90 47.14,32.31 47.23,32.31 arc-90 47.52,32.02 47.52,31.98 arc90 47.81,31.69 47.9,31.69 arc90 48.2,31.98 48.2,32.02 arc-90 48.48,32.31 48.58,32.31 arc-90 48.87,32.02 48.87,31.98 arc90 49.16,31.69 49.25,31.69 arc90 49.54,31.98 49.54,32.02 arc-90 49.83,32.31 49.92,32.31 arc-90 50.21,32.02 50.21,31.98 arc90 50.5,31.69 50.59,31.69 arc90 50.88,31.98 50.88,32.02 arc-90 51.17,32.31 51.26,32.31 arc-90 51.55,32.02 51.55,31.98 arc90 51.84,31.69 51.93,31.69 arc90 52.22,31.98 52.22,32.02 arc-90 52.51,32.31 52.6,32.31 arc-90 52.89,32.02 52.89,31.98 arc90 53.18,31.69 53.69,31.69 54.58,30.8 63.76,30.8 69.56,25 98.67,25 105.57,31.9 116.85,31.9 136.8,51.85 U$1.17
D0P
  Top 0.2: 26.7,16.15 J2.3 26.56,11.74 26.9,11.4 30.35,11.4 33.2,14.25 33.2,19.38 45.11,31.29 53.53,31.29 54.42,30.4 63.6,30.4 69.4,24.6 98.83,24.6 105.73,31.5 117.01,31.5 137.2,51.69 U$1.16
D1N
  Top 0.15: 25.65,16.1 J2.5
  Top 0.2: J2.5 25.65,16 25.65,18.47 27.88,20.7 32.28,20.7 45.07,33.49 45.12,33.49 arc90 45.41,33.78 45.41,33.97 arc-90 45.7,34.26 45.71,34.26 arc-90 46,33.97 46,33.78 arc90 46.29,33.49 46.3,33.49 arc90 46.59,33.78 46.59,33.97 arc-90 46.89,34.26 46.9,34.26 arc-90 47.19,33.97 47.19,33.78 arc90 47.48,33.49 47.49,33.49 arc90 47.78,33.78 47.78,33.97 arc-90 48.08,34.26 48.09,34.26 arc-90 48.38,33.97 48.38,33.78 arc90 48.67,33.49 53.57,33.49 55.06,32 64.26,32 70.06,26.2 98.18,26.2 105.08,33.1 116.37,33.1 135.6,52.33 U$1.20
D1P
  Top 0.2: J2.6 25.05,13.82 26.05,14.82 26.05,18.31 28.04,20.3 32.44,20.3 45.23,33.09 53.41,33.09 54.9,31.6 64.1,31.6 69.91,25.79 69.92,25.8 98.34,25.8 105.24,32.7 116.53,32.7 136,52.17 U$1.19
D2N
  Top 0.2: J2.11 22.55,12.35 22.3,12.1 21.84,12.1 21.54,12.4 21.54,14.06 21.03,14.57 21.03,17.73 23.5,20.2 24.02,20.2 26.92,23.1 31.3,23.1 45.3,37.1 53.33,37.1 56.03,34.4 65.23,34.4 71.03,28.6 97.21,28.6 104.11,35.5 115.39,35.5 133.2,53.31 U$1.26
D2P
  Top 0.2: J2.12 22.05,16.95 22.41,17.31 22.41,18.56 23.64,19.79 24.17,19.79 27.08,22.7 31.46,22.7 45.46,36.7 45.61,36.7 arc-90 45.9,36.41 45.9,36.23 arc90 46.19,35.94 46.23,35.94 arc90 46.52,36.23 46.52,36.41 arc-90 46.81,36.7 46.86,36.7 arc-90 47.15,36.41 47.15,36.23 arc90 47.44,35.94 47.48,35.94 arc90 47.77,36.23 47.77,36.41 arc-90 48.06,36.7 48.11,36.7 arc-90 48.4,36.41 48.4,36.23 arc90 48.69,35.94 48.73,35.94 arc90 49.02,36.23 49.02,36.41 arc-90 49.32,36.7 49.36,36.7 arc-90 49.65,36.41 49.65,36.23 arc90 49.94,35.94 49.99,35.94 arc90 50.28,36.23 50.28,36.41 arc-90 50.57,36.7 50.61,36.7 arc-90 50.9,36.41 50.9,36.23 arc90 51.19,35.94 51.24,35.94 arc90 51.53,36.23 51.53,36.41 arc-90 51.82,36.7 51.86,36.7 arc-90 52.15,36.41 52.15,36.23 arc90 52.44,35.94 52.49,35.94 arc90 52.78,36.23 52.78,36.41 arc-90 53.07,36.7 53.17,36.7 55.87,34 65.07,34 70.87,28.2 97.37,28.2 104.27,35.1 115.55,35.1 133.6,53.15 U$1.25
D3N
  Top 0.15: 21.1,13.25 J2.14
  Top 0.2: J2.14 21.05,13.95 20.04,14.96 20.04,17.94 26.4,24.3 30.8,24.3 45.4,38.9 53.22,38.9 56.52,35.6 65.73,35.6 71.53,29.8 96.7,29.8 103.6,36.7 114.9,36.7 132,53.8 U$1.29
D3P
  Top 0.2: 20.6,16.05 J2.15 20.55,17.85 26.6,23.9 30.98,23.9 45.58,38.5 45.76,38.5 arc-90 46.05,38.21 arc90 46.34,37.92 46.36,37.92 arc90 46.65,38.21 arc-90 46.94,38.5 46.96,38.5 arc-90 47.25,38.21 arc90 47.54,37.92 47.57,37.92 arc90 47.86,38.21 arc-90 48.15,38.5 48.17,38.5 arc-90 48.46,38.21 arc90 48.75,37.92 48.77,37.92 arc90 49.06,38.21 arc-90 49.35,38.5 49.38,38.5 arc-90 49.67,38.21 arc90 49.96,37.92 49.98,37.92 arc90 50.27,38.21 arc-90 50.56,38.5 50.59,38.5 arc-90 50.88,38.21 arc90 51.17,37.92 51.19,37.92 arc90 51.48,38.21 arc-90 51.77,38.5 53.06,38.5 56.36,35.2 65.57,35.2 71.37,29.4 96.87,29.4 103.77,36.3 115.06,36.3 132.4,53.63 U$1.28
GND_CARCASA  (via drill 0.6)
  Top 0.61: v2.42,73.8 2.42,72.17 2.78,71.81 4.07,71.81 J4.10 J4.9 J4.8 6.93,69.8 v7.11,69.81 | J4.4 5.97,65.8 v7.11,66.66
  GND_PLANE 0.61: 2.44,75.11 2.44,73.82 v2.42,73.8 | v7.11,66.66 v7.11,69.81
  GND_PLANE 1.422: GND_CARCASA.MP 2.41,75.14 2.44,75.11
GND_OPI  (via drill 0.3, 0.3 pad 0.6, 0.4, 0.5, 0.5 pad 0.2, 0.6, 0.9, 1.4)
  Top 0.15: J2.19 18.6,16.05
  Top 0.2: 132.8,58.9 U$1.4 132.8,58.4 132.7,58.3 131.8,58.3 131.6,58.5 U$1.1 131.6,60.04 131.57,60.07 v131.01,60.07 | J2.16 20.04,14.25 19.69,14.6 18.9,14.6 18.6,14.9 18.6,16.05 v18.6,17.2 | C2.1 C3.1 | 136.4,57.6 U$1.18 136.4,57.8 | U$1.15 137.2,58.6 136.4,57.8 | J2.1 27.55,16.85 28,17.3 v28,17.6 | J2.13 21.6,16.05 | J2.10 | U$1.10 135.2,58.7 v134.6,58.1 | v134.6,58.1 134.4,58.1 134,57.7 | 134,57.7 U$1.24 | v134.6,58.1 134.9,58.1 135.2,57.8 U$1.21 135.2,57.7 135.3,57.8 136.4,57.8 | U$1.30 131.6,57.6 131.8,57.8 | 131.8,57.8 132.7,57.8 132.8,57.7 | J2.4 26.05,12.05 v25.4,11.4 | 131.8,57.8 130.79,57.8 v129.87,58.82 | U$1.27 132.8,57.7 | 132.8,57.7 134,57.7
  Top 0.406: 9.1,31.97 U1.1 arc90 9.06,32 v7.3,32 | v1.3,34.7 0.8,34.2 0.8,32 1.3,31.5 C2.1 v3.5,31.5 | J2.16 20.05,12.05 20.5,11.6 22.7,11.6 | 22.7,11.6 23.1,12 | 23.1,12 23.1,13.15 J2.10 | v1.6,12.1 1.6,11.8 1.3,11.5 C4.1 C5.1 | IC2.2 28.41,36.1 v31.8,36.1 | v26.2,28.1 26.15,28.15 R2.1 | v22.7,10.8 22.7,11.6 | v25.4,11.4 23.7,11.4 23.1,12
  Top 0.61: J2.7 24.55,17.15 v24.8,17.4 | J2.13 21.55,17.34 v21.66,17.45 | 10K_GND.2 33.35,165.37 28.93,165.37 v26.42,162.86
  Top 1.016: v35.3,167.5 34.6,166.8 R3.1 10K_GND.2
  GND_PLANE 0.2: v129.87,58.82 arc-90 129.64,58.95 129.64,60
  GND_PLANE 0.406: 107.23,55.27 SV1.14 | SV1.20 | 17.3,17.2 17.48,17.2 | 17.48,17.2 v18.6,17.2 | v17.5,19.1 17.5,17.22 17.48,17.2 | v21.66,17.45 24.75,17.45 v24.8,17.4 27.8,17.4
  GND_PLANE 0.61: SV1.14 107.23,55.63 108.5,56.9 108.5,61.7 | 108.5,61.7 108.49,61.7 SV1.20 108.5,64.4 108.5,69.31 SV1.25 108.44,71.91 108.44,79.3 107.23,80.51 SV1.34 105.87,80.75 104.81,81.81 104.81,88.87 105.79,89.85 108.34,89.85 109.77,88.42 SV1.39 | 108.5,61.7 113.3,61.7 115,60 129.64,60 130.94,60 v131.01,60.07 | v26.42,162.86 15.56,152 15.56,50.17 10.09,44.7 5.9,44.7 1.29,40.09 v1.29,38.98 7.9,38.98 12.44,34.44 16.62,34.44 22.76,28.3 22.79,28.3 22.99,28.1 v26.2,28.1
  GND_PLANE 0.813: 109.74,50.26 108.5,51.4 108.5,54.07 SV1.14 | v3.5,31.5 4.45,30.45 | 4.45,30.45 v4.45,30 0.7,27 0.7,13 v1.6,12.1 8.4,12.1 13.5,17.2 17.3,17.2 | 4.45,30.45 6,32 v7.3,32
  GND_PLANE 1.016: SV1.9 109.74,50.26 | 104.6,46.5 104.6,54.3 105.57,55.27 107.23,55.27 107.63,55.27 | GND_LIDAR.1 98.7,46.5 104.6,46.5 | 104.6,46.5 105.8,45.3 105.95,45.18 SV1.6 | J1.5 J1.7 J1.10 | v28,17.6 28,26.3 v26.2,28.1
  GND_PLANE 1.27: v1.29,38.98 v1.3,34.7 | v26.2,28.1 29.4,28.1 31.8,30.5 v31.8,36.1 39.5,36.1 52.4,49 97.6,49 98.7,47.9 GND_LIDAR.1 | GND_OPI.MP 2.41,184.43 5.18,187.2 10.3,187.2 12.12,189.02 12.12,191.11 J1.5
  GND_PLANE 1.422: v35.3,167.5 35.3,193.08 | 35.3,193.08 35.29,193.08 | J1.10 20.76,197.25 33.74,197.25 35.31,195.68 35.31,193.09 35.3,193.08
  other vias: 58.93,36.69 63.93,36.69 68.23,34.69 71.23,31.69 86.23,30.69 76.23,30.69 81.23,30.69 90.23,30.69 94.23,30.69 98.23,32.69 101.73,36.19 111.53,37.69 115.03,38.09 117.83,40.89 121.73,44.69 125.73,48.69 129.73,52.69 130.73,55.69 127.53,56.19 127.43,63.09 132.03,63.09 129.73,63.09 139.33,60.59 139.83,57.79 138.33,54.39 138.03,50.89 134.33,47.29 128.93,41.89 126.13,39.09 123.23,36.19 118.33,31.49 131.53,44.39 104.43,28.89 101.93,25.99 98.73,23.69 94.73,23.69 90.73,23.69 86.73,23.69 82.73,23.69 78.73,23.69 74.73,23.69 70.73,23.69 67.14,25.23 64.07,28.36 60.73,29.69 56.73,29.69 52.83,30.19 48.73,30.19 44.93,29.59 41.73,26.69 38.73,23.69 35.73,20.69 34.33,17.59 34.23,13.49 37.73,7.69 33.03,5.39 27.73,5.89 22.93,5.79 17.73,5.69 13.73,8.19 11.73,11.69 11.73,17.69 15.53,21.89 31.52,26.38 25.33,24.79 21.73,21.19 35.16,30.04 38.68,33.48 42.83,37.49 45.73,39.69 49.73,39.69 54.33,39.39 134.23,63.09 120.63,33.69
  pour GND_PLANE: -4.33,218.8 48.91,218.8 48.91,57.14 92.44,57.14 92.44,99.76 150.48,99.76 150.48,13.11 51.22,13.11 51.22,-11.8 -4.33,-11.8
  pour Top: -6.86,50.66 34.31,50.66 34.31,59.31 97.29,59.31 97.29,69.6 97.29,100.63 154.92,100.63 154.92,-4.53 -8.37,-4.53 -8.37,50.66
GND_SERVOS
  GND_PLANE 1.422: GND_SERVOS.MP 2.4,177.22 4.46,179.28 25.69,179.28 | 25.69,179.28 29.52,179.28 SERVO_GND_GAT.MP | SERVO_GND_CARG.MP 30.91,184.5 25.69,179.28
GPIO-BTN1  (via drill 0.3, 0.5)
  Top 0.2: v117.1,47.8 117.1,47.72 SV1.7
  Top 0.61: J3.3 v139.2,39.6
  Bottom 0.2: 117.18,47.72 v117.1,47.8 | 117.1,47.83 v117.1,47.8 | v139.2,39.6 137.9,39.6 136.6,40.9 135.8,40.9 135.5,40.6 119.9,40.6 117.1,43.4 v117.1,47.8
GPIO-BTN2  (via drill 0.3, 0.5)
  Top 0.2: v122.8,55 v121.2,56.6
  Top 0.61: J3.4 v138.2,41.6
  Bottom 0.2: v121.2,56.6 113.6,64.2 108.7,64.2 107.4,65.5 SV1.22 | v122.8,55 136.2,41.6 v138.2,41.6
GPIO-LED1  (via drill 0.3, 0.5)
  Top 0.2: v123.6,56 v122.1,57.5
  Top 0.61: J3.5 v137.2,44.2
  Bottom 0.2: v122.1,57.5 118.4,61.2 118.4,81.4 113.98,85.82 SV1.37 | v123.6,56 135.4,44.2 v137.2,44.2
GPIO-LED2  (via drill 0.3, 0.5)
  Top 0.2: v121.5,53.9 v120,55.4 | v116.7,63.4 115,61.7 v115,61.6
  Top 0.61: J3.6 v136.2,40.3
  Bottom 0.2: v121.5,53.9 114.6,47 114.6,45.4 119.7,40.3 v136.2,40.3 | v120,55.4 115,60.4 v115,61.6
  Bottom 0.305: v116.7,63.4 116.7,76.5 111.2,82 108.51,82 SV1.36
N$1
  Top 0.2: C1.1 8.5,19.3 IC1.1
N$6  (via drill 0.3)
  Top 0.2: IC1.7 IC1.8 7.08,22.47 5.4,20.79 5.4,19.8 4.45,18.85 R5.2 3.85,18.85 4.6,18.1 C1.2 5.8,18
  Top 0.406: 5.8,18 v5.8,16.9 | R6.2 R7.1 4.1,11.95 v4.1,13.3
  Bottom 0.2: v5.8,16.9 4.1,15.4 v4.1,13.3
N$7  (via drill 0.3, 0.5 pad 0.2)
  Top 0.2: 10.44,2.05 v10.46,2.03
  Top 0.61: R4.2 10.46,2.05 v10.46,2.03 | J2.17 19.55,17.39 v19.5,17.44
  POWER 0.61: v10.46,2.03 16.44,2.03 19.55,5.14 19.5,5.19 v19.5,17.44
N$15  (via drill 0.3)
  Top 0.406: IC2.8 21.39,34.9 v20.7,34.2 | R2.2 24.28,30.03 v24.28,31.57
  POWER 0.406: v20.7,34.2 23.33,31.57 v24.28,31.57
OPI_CAN_RX  (via drill 0.5)
  Top 0.406: IC2.4
  Top 0.61: IC2.4 v30.1,38.7
  Bottom 0.406: SV1.3 109.77,42.77 111.8,44.8 111.8,45.5 110.77,46.45 106.66,46.44 99.7,39.5 92.01,39.5 88.82,42.69 34.09,42.69 v30.1,38.7
OPI_CAN_TX  (via drill 0.5)
  Top 0.406: 28.45,34.8 IC2.1
  Top 0.61: 28.45,34.8 v30.1,34.8
  Bottom 0.406: SV1.5 108.49,43.9 106.1,43.9 101.2,39 91.28,39 88.42,41.86 39.36,41.86 32.3,34.8 v30.1,34.8
PWM_GATILLO_OPI  (via drill 0.3)
  Top 0.406: R0_GAT_OPI.1 v34.9,161.4 | v29.2,159.9 19.6,159.9 v17,157.3 | v36.8,51.9 v36.8,48.2
  Bottom 0.406: v34.9,161.4 34.9,160.3 34.5,159.9 v29.2,159.9 | SV1.15 108.49,56.6 104.4,56.6 103.3,55.5 103.3,47.9 99.6,43.9 89,43.9 86.2,47.4 37.6,47.4 v36.8,48.2 | v17,157.3 15.5,155.8 15.5,108.9 38.2,96.5 38.2,53.3 v36.8,51.9
PWM_GATILLO_PORT  (via drill 0.3, 0.6)
  Top 0.406: v35.1,157.3 35.1,158.1 34.5,158.7 R0_GAT_PORT.2 | J1.4 8.3,192.41 8.3,184.9 13.8,179.4 20.8,179.4 v23.2,177
  Bottom 0.406: v35.1,157.3 34.8,157 30,157 23.2,163.8 v23.2,177
PWM_SYNC  (via drill 0.3)
  Top 0.406: v22.9,162 27.7,166.8 R3.2 v31.65,169.17 31.63,169.17 30.6,170.2 30.6,173.2 23.3,180.5 16,180.5 10.8,185.7 10.8,192.37 J1.6
  Bottom 0.406: SV1.32 102.7,78.2 101.1,76.6 101.1,51.1 99.9,49.9 41.9,49.9 41.2,50.6 41.2,98.6 18.4,111.1 18.4,154.3 20.1,156 20.1,159.2 v22.9,162
RX_LIDAR
  Bottom 0.2: SV1.31 108.5,76.93 108.5,75 107.9,74.4 103.9,74.4 101.8,72.3 101.8,50.8 100.2,49.2 94.6,49.2 94,48.6 94,46.3 RX_LIDAR.1
SCL1  (via drill 0.2 pad 0.2, 0.3, 0.3 pad 0.2)
  Top 0.2: v8.1,30.1 8.1,28.05 R8.1 8,27.95 v8,25.9 | IC1.3 9.62,23.18 v10.35,23.9 | v132.4,60.1 U$1.3
  Bottom 0.2: v8.1,30.1 8.5,30.5 15.1,30.5 15.6,30 28.2,30 39.42,41.22 88.05,41.22 90.67,38.6 111,38.6 113.2,40.8 113.2,47.3 127.9,62 131.3,62 132.4,60.9 v132.4,60.1 | v10.35,23.9 10,23.9 v8,25.9
SCL2  (via drill 0.3, 0.3 pad 0.2)
  Top 0.2: IC1.6 v4.81,23.17 3.82,23.17 2.7,22.05 R5.1
  Top 0.406: J2.20 18.05,14.05 17.5,14.6 v15.3,14.6
  Bottom 0.2: v4.81,23.17 7.08,20.9 9.5,20.9 10.5,22 11.5,22 14.6,18.9 14.6,15.3 v15.3,14.6
SDA1  (via drill 0.3, 0.3 pad 0.2)
  Top 0.2: v13.36,29.65 R9.1 | R9.1 | R9.1 arc90 13.3,27.95 v13.3,26.5 | v10.3,25 9.5,25 8.6,24.1 8.6,23.6 IC1.4 | v133.52,58.24 133.4,58.3 133.2,58.5 U$1.5
  Bottom 0.2: v13.36,29.65 28.25,29.65 39.34,40.74 87.83,40.74 90.27,38.3 111.1,38.3 113.5,40.7 113.5,47.2 124.54,58.24 v133.52,58.24 | v13.3,26.5 12.8,26.5 11.3,25 v10.3,25
SDA2  (via drill 0.2 pad 0.2, 0.3)
  Top 0.15: J2.21 17.55,16.85 v11.9,22.5
  Top 0.2: IC1.5 6.48,23.52 v5.2,24.8
  Top 0.406: R6.1 v5.9,7.1
  Bottom 0.2: v5.9,7.1 5.5,6.7 1.2,6.7 0.6,7.3 0.6,23.1 2.3,24.8 v5.2,24.8 6,24 6,22.7 7.4,21.3 9.2,21.3 10.4,22.5 v11.9,22.5
SERVO_CARGADOR_DATA  (via drill 0.3)
  Top 0.406: v37.8,51 37.8,50.1 v39.2,48.7
  POWER 0.406: v18,173.7 17.9,173.8 17.9,176.3 SERVO_DATA_CARG.MP
  Bottom 0.406: SV1.16 107.21,57.9 103.9,57.9 102.4,56.4 102.4,48.4 99.2,44.9 89.3,44.9 86.6,48.3 39.6,48.3 v39.2,48.7 | v18,173.7 18,157.2 16.2,155.4 16.2,109.5 38.9,97 38.98,96.94 38.98,52.18 v37.8,51
SERVO_GATILLO_DATA  (via drill 0.3)
  Top 0.406: v30.2,164.1 10K_GND.1 R0_GAT_OPI.2 R0_GAT_PORT.1
  Bottom 0.406: v30.2,164.1 30.2,170.1 32.2,172.1 SERVO_DATA_GAT.MP
TX_LIDAR
  Bottom 0.2: TX_LIDAR.1 91.9,48.8 92.6,49.5 100.1,49.5 101.5,50.9 101.5,74.7 103.6,76.8 107.8,76.8 108.5,77.5 108.5,79.47 SV1.33
VCC_3.3V  (via drill 0.5, 0.7)
  Top 0.406: 28.39,37.4 IC2.3
  Top 0.61: J3.7 v135.2,33.6 | 28.39,37.4 v30.7,37.4
  POWER 0.813: v30.7,37.4 31.23,37.4 32.67,38.84
  POWER 1.016: SV1.1 116.8,40.1 123.3,33.6 v135.2,33.6
  POWER 1.676: SV1.1 107.79,38.12 86.95,38.12 81.59,43.48 37.31,43.48 32.67,38.84

### Text on the board
tNames: 2 | 4 | 6 | 8 | 10 | 1 | 3 | 5 | 7 | 9 | K1 - Zen V0.1 Rev.5.6 / by Cypress Technologies S.L. | GND | SCL1 | GND | SDA1 | GND | CLK | 3V3 | 3V3 | GND | GND | D3N | D3P | GND | D2N | D2P | GND | CLKN | CLKP | GND | D1N | D1P | GND | D0N | D0P | GND | 3V3 | D3P | GND | D2N | CLKP | GND | D1N | D0P | GND | SDA2 | 3V3 | SCL2 | GND | D3N | D2P | GND | CLKN | D1P | GND | D0N | CAM_CLK